# Altium project LattePanda.PrjPcb (part 1 of 2)
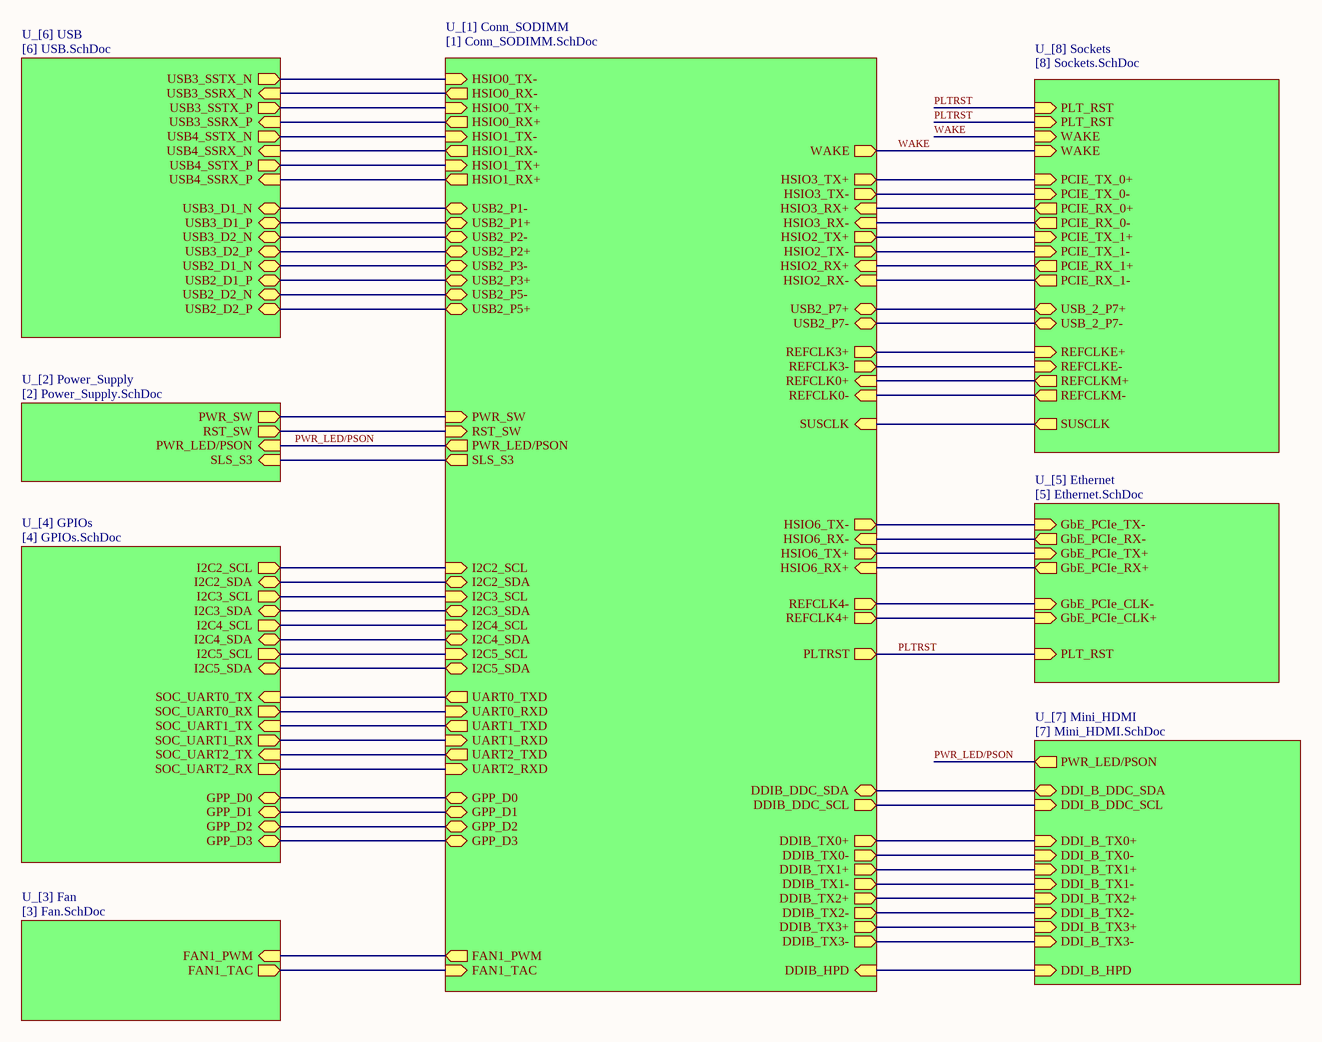
[diagram p0: [0] LattePanda_Mu.SchDoc]
8 sheets, 181 parts. Net scope: hierarchical (ports join the sheet entries above them; power ports are global).
Board file: LattePanda_Mu.PcbDoc
Sheets:
  [0] LattePanda_Mu.SchDoc
    U_[1] Conn_SODIMM = [1] Conn_SODIMM.SchDoc
    U_[2] Power_Supply = [2] Power_Supply.SchDoc
    U_[5] Ethernet = [5] Ethernet.SchDoc
    U_[6] USB = [6] USB.SchDoc
    U_[7] Mini_HDMI = [7] Mini_HDMI.SchDoc
    U_[8] Sockets = [8] Sockets.SchDoc
    U_[3] Fan = [3] Fan.SchDoc

## Sheet [0] LattePanda_Mu.SchDoc
size B; Organization: Altium Limited; Address1: L3, 12a Rodborough Rd; Address2: Frenchs Forest; Address3: NSW; Address4: Australia 2086

### Sub-sheets
U_[1] Conn_SODIMM = [1] Conn_SODIMM.SchDoc: SLS_S3 (out), HSIO2_TX+ (out), HSIO2_TX- (out), HSIO3_TX+ (out), HSIO3_TX- (out), HSIO6_TX+ (out), HSIO6_TX- (out), HSIO2_RX+ (in), HSIO2_RX- (in), HSIO3_RX+ (in), HSIO3_RX- (in), HSIO6_RX+ (in), HSIO6_RX- (in), USB2_P1- (bidir), USB2_P1+ (bidir), USB2_P2+ (bidir), USB2_P2- (bidir), USB2_P3+ (bidir), USB2_P3- (bidir), USB2_P7+ (bidir), USB2_P7- (bidir), DDIB_HPD (in), DDIB_DDC_SDA (bidir), DDIB_DDC_SCL (out), DDIB_TX3+ (out), DDIB_TX3- (out), DDIB_TX2+ (out), DDIB_TX2- (out), DDIB_TX1+ (out), DDIB_TX1- (out), DDIB_TX0+ (out), DDIB_TX0- (out), FAN1_TAC (in), FAN1_PWM (out), WAKE (out), PLTRST (out), USB2_P5+ (bidir), USB2_P5- (bidir), SUSCLK (in), GPP_D0 (bidir), GPP_D1 (bidir), GPP_D2 (bidir), GPP_D3 (bidir), UART0_RXD (in), UART0_TXD (out), UART1_RXD (in), UART1_TXD (out), UART2_RXD (in), UART2_TXD (out), I2C2_SDA (bidir), I2C3_SDA (bidir), I2C4_SDA (bidir), I2C5_SDA (bidir), I2C2_SCL (in), I2C3_SCL (in), I2C4_SCL (in), I2C5_SCL (in), PWR_SW (in), RST_SW (in), PWR_LED/PSON (out), HSIO0_TX+ (in), HSIO1_RX- (out), HSIO1_RX+ (out), HSIO0_RX- (out), HSIO0_RX+ (out), HSIO1_TX- (in), HSIO1_TX+ (in), HSIO0_TX- (in), REFCLK4+ (out), REFCLK4- (out), REFCLK0- (in), REFCLK0+ (in), REFCLK3+ (out), REFCLK3- (out)
U_[2] Power_Supply = [2] Power_Supply.SchDoc: SLS_S3 (in), PWR_LED/PSON (in), PWR_SW (out), RST_SW (out)
U_[3] Fan = [3] Fan.SchDoc: FAN1_TAC (out), FAN1_PWM (in)
U_[4] GPIOs = [4] GPIOs.SchDoc (file not in this document): I2C2_SDA (bidir), I2C3_SDA (bidir), I2C4_SDA (bidir), I2C5_SDA (bidir), I2C2_SCL (out), I2C3_SCL (out), I2C4_SCL (out), I2C5_SCL (out), SOC_UART0_RX (out), SOC_UART1_RX (out), SOC_UART2_RX (out), SOC_UART0_TX (in), SOC_UART1_TX (in), SOC_UART2_TX (in), GPP_D0 (bidir), GPP_D1 (bidir), GPP_D2 (bidir), GPP_D3 (bidir)
U_[5] Ethernet = [5] Ethernet.SchDoc: GbE_PCIe_TX- (in), GbE_PCIe_TX+ (in), GbE_PCIe_RX- (out), GbE_PCIe_RX+ (out), GbE_PCIe_CLK- (in), GbE_PCIe_CLK+ (in), PLT_RST (in)
U_[6] USB = [6] USB.SchDoc: USB3_SSRX_N (in), USB3_SSRX_P (in), USB3_SSTX_N (out), USB3_SSTX_P (out), USB4_SSRX_N (in), USB4_SSRX_P (in), USB4_SSTX_N (out), USB4_SSTX_P (out), USB2_D2_P (bidir), USB2_D1_P (bidir), USB3_D1_P (bidir), USB2_D1_N (bidir), USB3_D2_P (bidir), USB3_D1_N (bidir), USB3_D2_N (bidir), USB2_D2_N (bidir)
U_[7] Mini_HDMI = [7] Mini_HDMI.SchDoc: DDI_B_TX0+ (in), DDI_B_TX0- (in), DDI_B_TX1+ (in), DDI_B_TX1- (in), DDI_B_TX2+ (in), DDI_B_TX2- (in), DDI_B_TX3+ (in), DDI_B_TX3- (in), PWR_LED/PSON (out), DDI_B_DDC_SDA (bidir), DDI_B_HPD (in), DDI_B_DDC_SCL (in)
U_[8] Sockets = [8] Sockets.SchDoc: PLT_RST (in), WAKE (in), PCIE_TX_1+ (in), PCIE_TX_1- (in), PCIE_RX_1+ (out), PCIE_RX_1- (out), REFCLKM+ (out), REFCLKM- (out), PLT_RST (in), WAKE (in), PCIE_TX_0+ (in), PCIE_TX_0- (in), PCIE_RX_0+ (out), PCIE_RX_0- (out), USB_2_P7+ (bidir), USB_2_P7- (bidir), REFCLKE+ (in), REFCLKE- (in), SUSCLK (out)

### Nets
PLTRST: sheet U_[1] Conn_SODIMM/PLTRST, sheet U_[5] Ethernet/PLT_RST, sheet U_[8] Sockets/PLT_RST, sheet U_[8] Sockets/PLT_RST
PWR_LED/PSON: sheet U_[1] Conn_SODIMM/PWR_LED/PSON, sheet U_[2] Power_Supply/PWR_LED/PSON, sheet U_[7] Mini_HDMI/PWR_LED/PSON
PWR_SW: sheet U_[1] Conn_SODIMM/PWR_SW, sheet U_[2] Power_Supply/PWR_SW
RST_SW: sheet U_[1] Conn_SODIMM/RST_SW, sheet U_[2] Power_Supply/RST_SW
SLS_S3: sheet U_[1] Conn_SODIMM/SLS_S3, sheet U_[2] Power_Supply/SLS_S3
STDA_SSRX1_N: sheet U_[1] Conn_SODIMM/HSIO0_RX-, sheet U_[6] USB/USB3_SSRX_N
STDA_SSRX1_P: sheet U_[1] Conn_SODIMM/HSIO0_RX+, sheet U_[6] USB/USB3_SSRX_P
STDA_SSRX2_N: sheet U_[1] Conn_SODIMM/HSIO1_RX-, sheet U_[6] USB/USB4_SSRX_N
STDA_SSRX2_P: sheet U_[1] Conn_SODIMM/HSIO1_RX+, sheet U_[6] USB/USB4_SSRX_P
TMD_CK_N: sheet U_[1] Conn_SODIMM/DDIB_TX3-, sheet U_[7] Mini_HDMI/DDI_B_TX3-
TMD_CK_P: sheet U_[1] Conn_SODIMM/DDIB_TX3+, sheet U_[7] Mini_HDMI/DDI_B_TX3+
TMD_D0_N: sheet U_[1] Conn_SODIMM/DDIB_TX2-, sheet U_[7] Mini_HDMI/DDI_B_TX2-
TMD_D0_P: sheet U_[1] Conn_SODIMM/DDIB_TX2+, sheet U_[7] Mini_HDMI/DDI_B_TX2+
TMD_D1_N: sheet U_[1] Conn_SODIMM/DDIB_TX1-, sheet U_[7] Mini_HDMI/DDI_B_TX1-
TMD_D1_P: sheet U_[1] Conn_SODIMM/DDIB_TX1+, sheet U_[7] Mini_HDMI/DDI_B_TX1+
TMD_D2_N: sheet U_[1] Conn_SODIMM/DDIB_TX0-, sheet U_[7] Mini_HDMI/DDI_B_TX0-
TMD_D2_P: sheet U_[1] Conn_SODIMM/DDIB_TX0+, sheet U_[7] Mini_HDMI/DDI_B_TX0+
USB2_D1_N: sheet U_[1] Conn_SODIMM/USB2_P3-, sheet U_[6] USB/USB2_D1_N
USB2_D1_P: sheet U_[1] Conn_SODIMM/USB2_P3+, sheet U_[6] USB/USB2_D1_P
USB2_D2_N: sheet U_[1] Conn_SODIMM/USB2_P5-, sheet U_[6] USB/USB2_D2_N
USB2_D2_P: sheet U_[1] Conn_SODIMM/USB2_P5+, sheet U_[6] USB/USB2_D2_P
USB3_D1_N: sheet U_[1] Conn_SODIMM/USB2_P1-, sheet U_[6] USB/USB3_D1_N
USB3_D1_P: sheet U_[1] Conn_SODIMM/USB2_P1+, sheet U_[6] USB/USB3_D1_P
USB3_D2_N: sheet U_[1] Conn_SODIMM/USB2_P2-, sheet U_[6] USB/USB3_D2_N
USB3_D2_P: sheet U_[1] Conn_SODIMM/USB2_P2+, sheet U_[6] USB/USB3_D2_P
USB3_SSTX_N: sheet U_[1] Conn_SODIMM/HSIO0_TX-, sheet U_[6] USB/USB3_SSTX_N
USB3_SSTX_P: sheet U_[1] Conn_SODIMM/HSIO0_TX+, sheet U_[6] USB/USB3_SSTX_P
USB4_SSTX_N: sheet U_[1] Conn_SODIMM/HSIO1_TX-, sheet U_[6] USB/USB4_SSTX_N
USB4_SSTX_P: sheet U_[1] Conn_SODIMM/HSIO1_TX+, sheet U_[6] USB/USB4_SSTX_P
WAKE: sheet U_[1] Conn_SODIMM/WAKE, sheet U_[8] Sockets/WAKE, sheet U_[8] Sockets/WAKE
NetC30_2: sheet U_[1] Conn_SODIMM/HSIO6_TX-, sheet U_[5] Ethernet/GbE_PCIe_TX-
NetC31_2: sheet U_[1] Conn_SODIMM/HSIO6_TX+, sheet U_[5] Ethernet/GbE_PCIe_TX+
NetC32_2: sheet U_[1] Conn_SODIMM/HSIO6_RX-, sheet U_[5] Ethernet/GbE_PCIe_RX-
NetC33_2: sheet U_[1] Conn_SODIMM/HSIO6_RX+, sheet U_[5] Ethernet/GbE_PCIe_RX+
NetC57_2: sheet U_[1] Conn_SODIMM/HSIO3_TX+, sheet U_[8] Sockets/PCIE_TX_0+
NetC58_2: sheet U_[1] Conn_SODIMM/HSIO3_TX-, sheet U_[8] Sockets/PCIE_TX_0-
NetC59_2: sheet U_[1] Conn_SODIMM/HSIO2_TX+, sheet U_[8] Sockets/PCIE_TX_1+
NetC60_2: sheet U_[1] Conn_SODIMM/HSIO2_TX-, sheet U_[8] Sockets/PCIE_TX_1-
NetJ3_2: sheet U_[1] Conn_SODIMM/FAN1_PWM, sheet U_[3] Fan/FAN1_PWM
NetJ3_4: sheet U_[1] Conn_SODIMM/FAN1_TAC, sheet U_[3] Fan/FAN1_TAC
NetJ3_28: sheet U_[1] Conn_SODIMM/HSIO2_RX+, sheet U_[8] Sockets/PCIE_RX_1+
NetJ3_30: sheet U_[1] Conn_SODIMM/HSIO2_RX-, sheet U_[8] Sockets/PCIE_RX_1-
NetJ3_34: sheet U_[1] Conn_SODIMM/HSIO3_RX+, sheet U_[8] Sockets/PCIE_RX_0+
NetJ3_36: sheet U_[1] Conn_SODIMM/HSIO3_RX-, sheet U_[8] Sockets/PCIE_RX_0-
NetJ3_76: sheet U_[1] Conn_SODIMM/USB2_P7+, sheet U_[8] Sockets/USB_2_P7+
NetJ3_78: sheet U_[1] Conn_SODIMM/USB2_P7-, sheet U_[8] Sockets/USB_2_P7-
NetJ3_85: sheet U_[1] Conn_SODIMM/REFCLK0+, sheet U_[8] Sockets/REFCLKM+
NetJ3_87: sheet U_[1] Conn_SODIMM/REFCLK0-, sheet U_[8] Sockets/REFCLKM-
NetJ3_88: sheet U_[1] Conn_SODIMM/REFCLK3+, sheet U_[8] Sockets/REFCLKE+
NetJ3_90: sheet U_[1] Conn_SODIMM/REFCLK3-, sheet U_[8] Sockets/REFCLKE-
NetJ3_94: sheet U_[1] Conn_SODIMM/REFCLK4+, sheet U_[5] Ethernet/GbE_PCIe_CLK+
NetJ3_96: sheet U_[1] Conn_SODIMM/REFCLK4-, sheet U_[5] Ethernet/GbE_PCIe_CLK-
NetJ3_128: sheet U_[1] Conn_SODIMM/GPP_D0, sheet U_[4] GPIOs/GPP_D0
NetJ3_130: sheet U_[1] Conn_SODIMM/GPP_D1, sheet U_[4] GPIOs/GPP_D1
NetJ3_131: sheet U_[1] Conn_SODIMM/SUSCLK, sheet U_[8] Sockets/SUSCLK
NetJ3_132: sheet U_[1] Conn_SODIMM/GPP_D2, sheet U_[4] GPIOs/GPP_D2
NetJ3_134: sheet U_[1] Conn_SODIMM/GPP_D3, sheet U_[4] GPIOs/GPP_D3
NetJ3_137: sheet U_[1] Conn_SODIMM/UART0_RXD, sheet U_[4] GPIOs/SOC_UART0_RX
NetJ3_138: sheet U_[1] Conn_SODIMM/UART2_TXD, sheet U_[4] GPIOs/SOC_UART2_TX
NetJ3_139: sheet U_[1] Conn_SODIMM/UART0_TXD, sheet U_[4] GPIOs/SOC_UART0_TX
NetJ3_140: sheet U_[1] Conn_SODIMM/UART2_RXD, sheet U_[4] GPIOs/SOC_UART2_RX
NetJ3_141: sheet U_[1] Conn_SODIMM/UART1_RXD, sheet U_[4] GPIOs/SOC_UART1_RX
NetJ3_142: sheet U_[1] Conn_SODIMM/I2C5_SCL, sheet U_[4] GPIOs/I2C5_SCL
NetJ3_143: sheet U_[1] Conn_SODIMM/UART1_TXD, sheet U_[4] GPIOs/SOC_UART1_TX
NetJ3_144: sheet U_[1] Conn_SODIMM/I2C5_SDA, sheet U_[4] GPIOs/I2C5_SDA
NetJ3_146: sheet U_[1] Conn_SODIMM/I2C4_SCL, sheet U_[4] GPIOs/I2C4_SCL
NetJ3_148: sheet U_[1] Conn_SODIMM/I2C4_SDA, sheet U_[4] GPIOs/I2C4_SDA
NetJ3_150: sheet U_[1] Conn_SODIMM/I2C3_SCL, sheet U_[4] GPIOs/I2C3_SCL
NetJ3_152: sheet U_[1] Conn_SODIMM/I2C3_SDA, sheet U_[4] GPIOs/I2C3_SDA
NetJ3_154: sheet U_[1] Conn_SODIMM/I2C2_SCL, sheet U_[4] GPIOs/I2C2_SCL
NetJ3_156: sheet U_[1] Conn_SODIMM/I2C2_SDA, sheet U_[4] GPIOs/I2C2_SDA
NetJ3_169: sheet U_[1] Conn_SODIMM/DDIB_DDC_SDA, sheet U_[7] Mini_HDMI/DDI_B_DDC_SDA
NetJ3_171: sheet U_[1] Conn_SODIMM/DDIB_DDC_SCL, sheet U_[7] Mini_HDMI/DDI_B_DDC_SCL
NetJ3_183: sheet U_[1] Conn_SODIMM/DDIB_HPD, sheet U_[7] Mini_HDMI/DDI_B_HPD

### Notes on the sheet
- Title
- Size:
- Date:
- B
- Number:
- Time:
- Revision:
- Sheet
- of
- File:

## Sheet [1] Conn_SODIMM.SchDoc
size A2 portrait; Organization: Altium Limited; Address1: L3, 12a Rodborough Rd; Address2: Frenchs Forest; Address3: NSW; Address4: Australia 2086
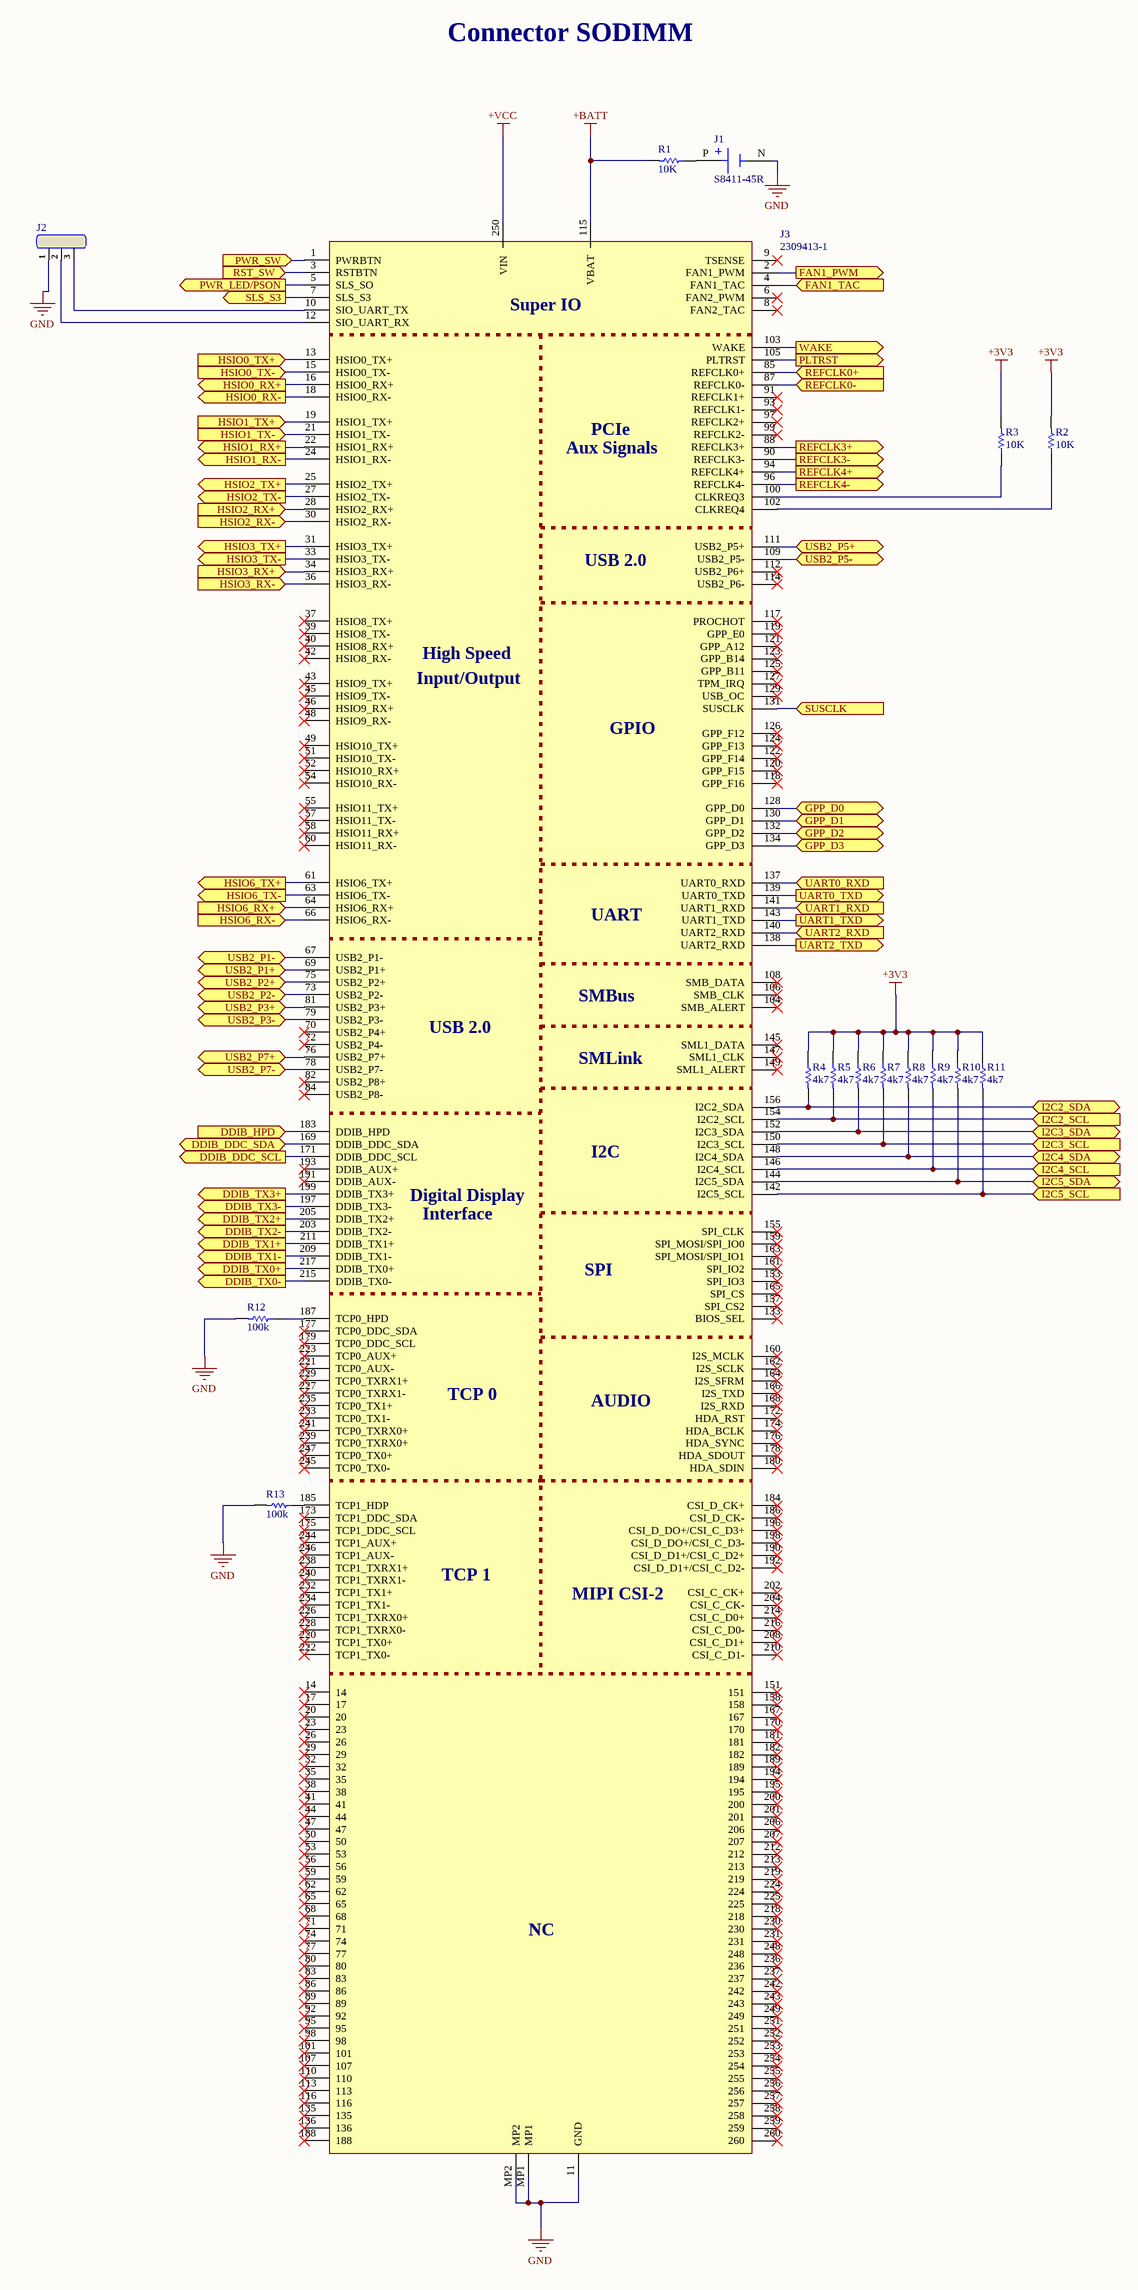
[diagram p1: [1] Conn_SODIMM.SchDoc]

### Parts
J1  S8411-45R  [HARWIN_S8411-45R]
J2  Header 3x1  [HM 3X1]  (value not drawn)
J3  2309413-1  [23094131]
R1  10K  [Resistencia 0402]
R2  10K  [Resistencia 0402]
R3  10K  [Resistencia 0402]
R4  4k7  [Resistencia 0402]
R5  4k7  [Resistencia 0402]
R6  4k7  [Resistencia 0402]
R7  4k7  [Resistencia 0402]
R8  4k7  [Resistencia 0402]
R9  4k7  [Resistencia 0402]
R10  4k7  [Resistencia 0402]
R11  4k7  [Resistencia 0402]
R12  100k  [Resistencia 0402]
R13  100k  [Resistencia 0402]

### Ports
DDIB_DDC_SCL (out), DDIB_DDC_SDA (bidir), DDIB_HPD (in), DDIB_TX0+ (out), DDIB_TX0- (out), DDIB_TX1+ (out), DDIB_TX1- (out), DDIB_TX2+ (out), DDIB_TX2- (out), DDIB_TX3+ (out), DDIB_TX3- (out), FAN1_PWM (out), FAN1_TAC (in), GPP_D0 (bidir), GPP_D1 (bidir), GPP_D2 (bidir), GPP_D3 (bidir), HSIO0_RX+ (out), HSIO0_RX- (out), HSIO0_TX+ (in), HSIO0_TX- (in), HSIO1_RX+ (out), HSIO1_RX- (out), HSIO1_TX+ (in), HSIO1_TX- (in), HSIO2_RX+ (in), HSIO2_RX- (in), HSIO2_TX+ (out), HSIO2_TX- (out), HSIO3_RX+ (in), HSIO3_RX- (in), HSIO3_TX+ (out), HSIO3_TX- (out), HSIO6_RX+ (in), HSIO6_RX- (in), HSIO6_TX+ (out), HSIO6_TX- (out), I2C2_SCL (in), I2C2_SDA (bidir), I2C3_SCL (in), I2C3_SDA (bidir), I2C4_SCL (in), I2C4_SDA (bidir), I2C5_SCL (in), I2C5_SDA (bidir), PLTRST (out), PWR_LED/PSON (out), PWR_SW (in), REFCLK0+ (in), REFCLK0- (in), REFCLK3+ (out), REFCLK3- (out), REFCLK4+ (out), REFCLK4- (out), RST_SW (in), SLS_S3 (out), SUSCLK (in), UART0_RXD (in), UART0_TXD (out), UART1_RXD (in), UART1_TXD (out), UART2_RXD (in), UART2_TXD (out), USB2_P1+ (bidir), USB2_P1- (bidir), USB2_P2+ (bidir), USB2_P2- (bidir), USB2_P3+ (bidir), USB2_P3- (bidir), USB2_P5+ (bidir), USB2_P5- (bidir), USB2_P7+ (bidir), USB2_P7- (bidir), WAKE (out)

### Nets
+3V3: R2.1(A) R3.1(A) R4.2(B) R5.2(B) R6.2(B) R7.2(B) R8.2(B) R9.2(B) R10.2(B) R11.2(B)
+BATT: J3.115(VBAT) R1.1(A)
+VCC: J3.250(VIN)
GND: J1.N(NEG) J2.1 J3.11(GND) J3.MP1 J3.MP2 R12.1(A) R13.1(A)
PLTRST: J3.105(PLTRST) ; port PLTRST
PWR_LED/PSON: J3.5(SLS_SO) ; port PWR_LED/PSON
PWR_SW: J3.1(PWRBTN) ; port PWR_SW
RST_SW: J3.3(RSTBTN) ; port RST_SW
SLS_S3: J3.7(SLS_S3) ; port SLS_S3
STDA_SSRX1_N: J3.18(HSIO0_RX-) ; port HSIO0_RX-
STDA_SSRX1_P: J3.16(HSIO0_RX+) ; port HSIO0_RX+
STDA_SSRX2_N: J3.24(HSIO1_RX-) ; port HSIO1_RX-
STDA_SSRX2_P: J3.22(HSIO1_RX+) ; port HSIO1_RX+
TMD_CK_N: J3.197(DDIB_TX3-) ; port DDIB_TX3-
TMD_CK_P: J3.199(DDIB_TX3+) ; port DDIB_TX3+
TMD_D0_N: J3.203(DDIB_TX2-) ; port DDIB_TX2-
TMD_D0_P: J3.205(DDIB_TX2+) ; port DDIB_TX2+
TMD_D1_N: J3.209(DDIB_TX1-) ; port DDIB_TX1-
TMD_D1_P: J3.211(DDIB_TX1+) ; port DDIB_TX1+
TMD_D2_N: J3.215(DDIB_TX0-) ; port DDIB_TX0-
TMD_D2_P: J3.217(DDIB_TX0+) ; port DDIB_TX0+
USB2_D1_N: J3.79(USB2_P3-) ; port USB2_P3-
USB2_D1_P: J3.81(USB2_P3+) ; port USB2_P3+
USB2_D2_N: J3.109(USB2_P5-) ; port USB2_P5-
USB2_D2_P: J3.111(USB2_P5+) ; port USB2_P5+
USB3_D1_N: J3.67(USB2_P1-) ; port USB2_P1-
USB3_D1_P: J3.69(USB2_P1+) ; port USB2_P1+
USB3_D2_N: J3.73(USB2_P2-) ; port USB2_P2-
USB3_D2_P: J3.75(USB2_P2+) ; port USB2_P2+
USB3_SSTX_N: J3.15(HSIO0_TX-) ; port HSIO0_TX-
USB3_SSTX_P: J3.13(HSIO0_TX+) ; port HSIO0_TX+
USB4_SSTX_N: J3.21(HSIO1_TX-) ; port HSIO1_TX-
USB4_SSTX_P: J3.19(HSIO1_TX+) ; port HSIO1_TX+
WAKE: J3.103(WAKE) ; port WAKE
NetC30_2: J3.63(HSIO6_TX-) ; port HSIO6_TX-
NetC31_2: J3.61(HSIO6_TX+) ; port HSIO6_TX+
NetC32_2: J3.66(HSIO6_RX-) ; port HSIO6_RX-
NetC33_2: J3.64(HSIO6_RX+) ; port HSIO6_RX+
NetC57_2: J3.31(HSIO3_TX+) ; port HSIO3_TX+
NetC58_2: J3.33(HSIO3_TX-) ; port HSIO3_TX-
NetC59_2: J3.25(HSIO2_TX+) ; port HSIO2_TX+
NetC60_2: J3.27(HSIO2_TX-) ; port HSIO2_TX-
NetJ1_P: J1.P(POS) R1.2(B)
NetJ2_2: J2.2 J3.12(SIO_UART_RX)
NetJ2_3: J2.3 J3.10(SIO_UART_TX)
NetJ3_2: J3.2(FAN1_PWM) ; port FAN1_PWM
NetJ3_4: J3.4(FAN1_TAC) ; port FAN1_TAC
NetJ3_28: J3.28(HSIO2_RX+) ; port HSIO2_RX+
NetJ3_30: J3.30(HSIO2_RX-) ; port HSIO2_RX-
NetJ3_34: J3.34(HSIO3_RX+) ; port HSIO3_RX+
NetJ3_36: J3.36(HSIO3_RX-) ; port HSIO3_RX-
NetJ3_76: J3.76(USB2_P7+) ; port USB2_P7+
NetJ3_78: J3.78(USB2_P7-) ; port USB2_P7-
NetJ3_85: J3.85(REFCLK0+) ; port REFCLK0+
NetJ3_87: J3.87(REFCLK0-) ; port REFCLK0-
NetJ3_88: J3.88(REFCLK3+) ; port REFCLK3+
NetJ3_90: J3.90(REFCLK3-) ; port REFCLK3-
NetJ3_94: J3.94(REFCLK4+) ; port REFCLK4+
NetJ3_96: J3.96(REFCLK4-) ; port REFCLK4-
NetJ3_100: J3.100(CLKREQ3) R3.2(B)
NetJ3_102: J3.102(CLKREQ4) R2.2(B)
NetJ3_128: J3.128(GPP_D0) ; port GPP_D0
NetJ3_130: J3.130(GPP_D1) ; port GPP_D1
NetJ3_131: J3.131(SUSCLK) ; port SUSCLK
NetJ3_132: J3.132(GPP_D2) ; port GPP_D2
NetJ3_134: J3.134(GPP_D3) ; port GPP_D3
NetJ3_137: J3.137(UART0_RXD) ; port UART0_RXD
NetJ3_138: J3.138(UART2_RXD) ; port UART2_TXD
NetJ3_139: J3.139(UART0_TXD) ; port UART0_TXD
NetJ3_140: J3.140(UART2_RXD) ; port UART2_RXD
NetJ3_141: J3.141(UART1_RXD) ; port UART1_RXD
NetJ3_142: J3.142(I2C5_SCL) R11.1(A) ; port I2C5_SCL
NetJ3_143: J3.143(UART1_TXD) ; port UART1_TXD
NetJ3_144: J3.144(I2C5_SDA) R10.1(A) ; port I2C5_SDA
NetJ3_146: J3.146(I2C4_SCL) R9.1(A) ; port I2C4_SCL
NetJ3_148: J3.148(I2C4_SDA) R8.1(A) ; port I2C4_SDA
NetJ3_150: J3.150(I2C3_SCL) R7.1(A) ; port I2C3_SCL
NetJ3_152: J3.152(I2C3_SDA) R6.1(A) ; port I2C3_SDA
NetJ3_154: J3.154(I2C2_SCL) R5.1(A) ; port I2C2_SCL
NetJ3_156: J3.156(I2C2_SDA) R4.1(A) ; port I2C2_SDA
NetJ3_169: J3.169(DDIB_DDC_SDA) ; port DDIB_DDC_SDA
NetJ3_171: J3.171(DDIB_DDC_SCL) ; port DDIB_DDC_SCL
NetJ3_183: J3.183(DDIB_HPD) ; port DDIB_HPD
NetJ3_185: J3.185(TCP1_HDP) R13.2(B)
NetJ3_187: J3.187(TCP0_HPD) R12.2(B)

Not connected (* = marked no-connect by the designer): J3 6(FAN2_PWM)* 8(FAN2_TAC)* 9(TSENSE)* 14* 17* 20* 23* 26* 29* 32* 35* 37(HSIO8_TX+)* 38* 39(HSIO8_TX-)* 40(HSIO8_RX+)* 41* 42(HSIO8_RX-)* 43(HSIO9_TX+)* 44* 45(HSIO9_TX-)* 46(HSIO9_RX+)* 47* 48(HSIO9_RX-)* 49(HSIO10_TX+)* 50* 51(HSIO10_TX-)* 52(HSIO10_RX+)* 53* 54(HSIO10_RX-)* 55(HSIO11_TX+)* 56* 57(HSIO11_TX-)* 58(HSIO11_RX+)* 59* 60(HSIO11_RX-)* 62* 65* 68* 70(USB2_P4+)* 71* 72(USB2_P4-)* 74* 77* 80* 82(USB2_P8+)* 83* 84(USB2_P8-)* 86* 89* 91(REFCLK1+)* 92* 93(REFCLK1-)* 95* 97(REFCLK2+)* 98* 99(REFCLK2-)* 101* 104(SMB_ALERT)* 106(SMB_CLK)* 107* 108(SMB_DATA)* 110* 112(USB2_P6+)* 113* 114(USB2_P6-)* 116* 117(PROCHOT)* 118(GPP_F16)* 119(GPP_E0)* 120(GPP_F15)* 121(GPP_A12)* 122(GPP_F14)* 123(GPP_B14)* 124(GPP_F13)* 125(GPP_B11)* 126(GPP_F12)* 127(TPM_IRQ)* 129(USB_OC)* 133(BIOS_SEL)* 135* 136* 145(SML1_DATA)* 147(SML1_CLK)* 149(SML1_ALERT)* 151* 153(SPI_IO3)* 155(SPI_CLK)* 157(SPI_CS2)* 158* 159(SPI_MOSI/SPI_IO0)* 160(I2S_MCLK)* 161(SPI_IO2)* 162(I2S_SCLK)* 163(SPI_MOSI/SPI_IO1)* 164(I2S_SFRM)* 165(SPI_CS)* 166(I2S_TXD)* 167* 168(I2S_RXD)* 170* 172(HDA_RST)* 173(TCP1_DDC_SDA)* 174(HDA_BCLK)* 175(TCP1_DDC_SCL)* 176(HDA_SYNC)* 177(TCP0_DDC_SDA)* 178(HDA_SDOUT)* 179(TCP0_DDC_SCL)* 180(HDA_SDIN)* 181* 182* 184(CSI_D_CK+)* 186(CSI_D_CK-)* 188* 189* 190(CSI_D_D1+/CSI_C_D2+)* 191(DDIB_AUX-)* 192(CSI_D_D1+/CSI_C_D2-)* 193(DDIB_AUX+)* 194* 195* 196(CSI_D_DO+/CSI_C_D3+)* 198(CSI_D_DO+/CSI_C_D3-)* 200* 201* 202(CSI_C_CK+)* 204(CSI_C_CK-)* 206* 207* 208(CSI_C_D1+)* 210(CSI_C_D1-)* 212* 213* 214(CSI_C_D0+)* 216(CSI_C_D0-)* 218* 219* 220(TCP1_TX0+)* 221(TCP0_AUX-)* 222(TCP1_TX0-)* 223(TCP0_AUX+)* 224* 225* 226(TCP1_TXRX0+)* 227(TCP0_TXRX1-)* 228(TCP1_TXRX0-)* 229(TCP0_TXRX1+)* 230* 231* 232(TCP1_TX1+)* 233(TCP0_TX1-)* 234(TCP1_TX1-)* 235(TCP0_TX1+)* 236* 237* 238(TCP1_TXRX1+)* 239(TCP0_TXRX0+)* 240(TCP1_TXRX1-)* 241(TCP0_TXRX0+)* 242* 243* 244(TCP1_AUX+)* 245(TCP0_TX0-)* 246(TCP1_AUX-)* 247(TCP0_TX0+)* 248* 249* 251* 252* 253* 254* 255* 256* 257* 258* 259* 260*

### Notes on the sheet
- Connector SODIMM
- Title
- Size:
- Date:
- File:
- A2
- Number:
- Time:
- Revision:
- Sheet
- of
- (in symbol 2309413-1) Super IO; PCIe; Aux Signals; USB 2.0; High Speed; Input/Output; GPIO; UART; SMBus; SMLink; I2C; Digital Display; Interface; SPI; TCP 0; AUDIO; TCP 1; MIPI CSI-2; NC

### Library data of the parts
J1 = S8411-45R: Coin Cell Battery Retainer, Horizontal SMT, for CR1220 Coin Cell Batteries, Tape & Reeled; MF: Harwin; SnapEDA_Link: https://www.snapeda.com/parts/S8411-45R/Harwin+Inc./view-part/?ref=snap; Package: None; Value: *; MP: S8411-45R; Check_prices: https://www.snapeda.com/parts/S8411-45R/Harwin+Inc./view-part/?ref=eda
J2 = HM 3x1: Header Macho 3x1 2.54mm
J3 = 2309413-1: Body Features: Module Key Type Offset Left; Manufacturer_Name: TE Connectivity; Geometry.Height: 9.45mm; Mouser Part Number: 571-2309413-1; Mouser Price/Stock: https://www.mouser.co.uk/ProductDetail/TE-Connectivity/2309413-1?qs=1mbolxNpo8ckNkoYMswDaw%3D%3D; Manufacturer_Part_Number: 2309413-1; Datasheet Link: https://www.te.com/commerce/DocumentDelivery/DDEController?Action=showdoc&DocId=Customer+Drawing%7F2309413%7F3%7Fpdf%7FEnglish%7FENG_CD_2309413_3.pdf%7F2309413-1
R1-R13 = Resistencia SMD 0402

## Sheet [2] Power_Supply.SchDoc
size C; Organization: Altium Limited; Address1: L3, 12a Rodborough Rd; Address2: Frenchs Forest; Address3: NSW; Address4: Australia 2086
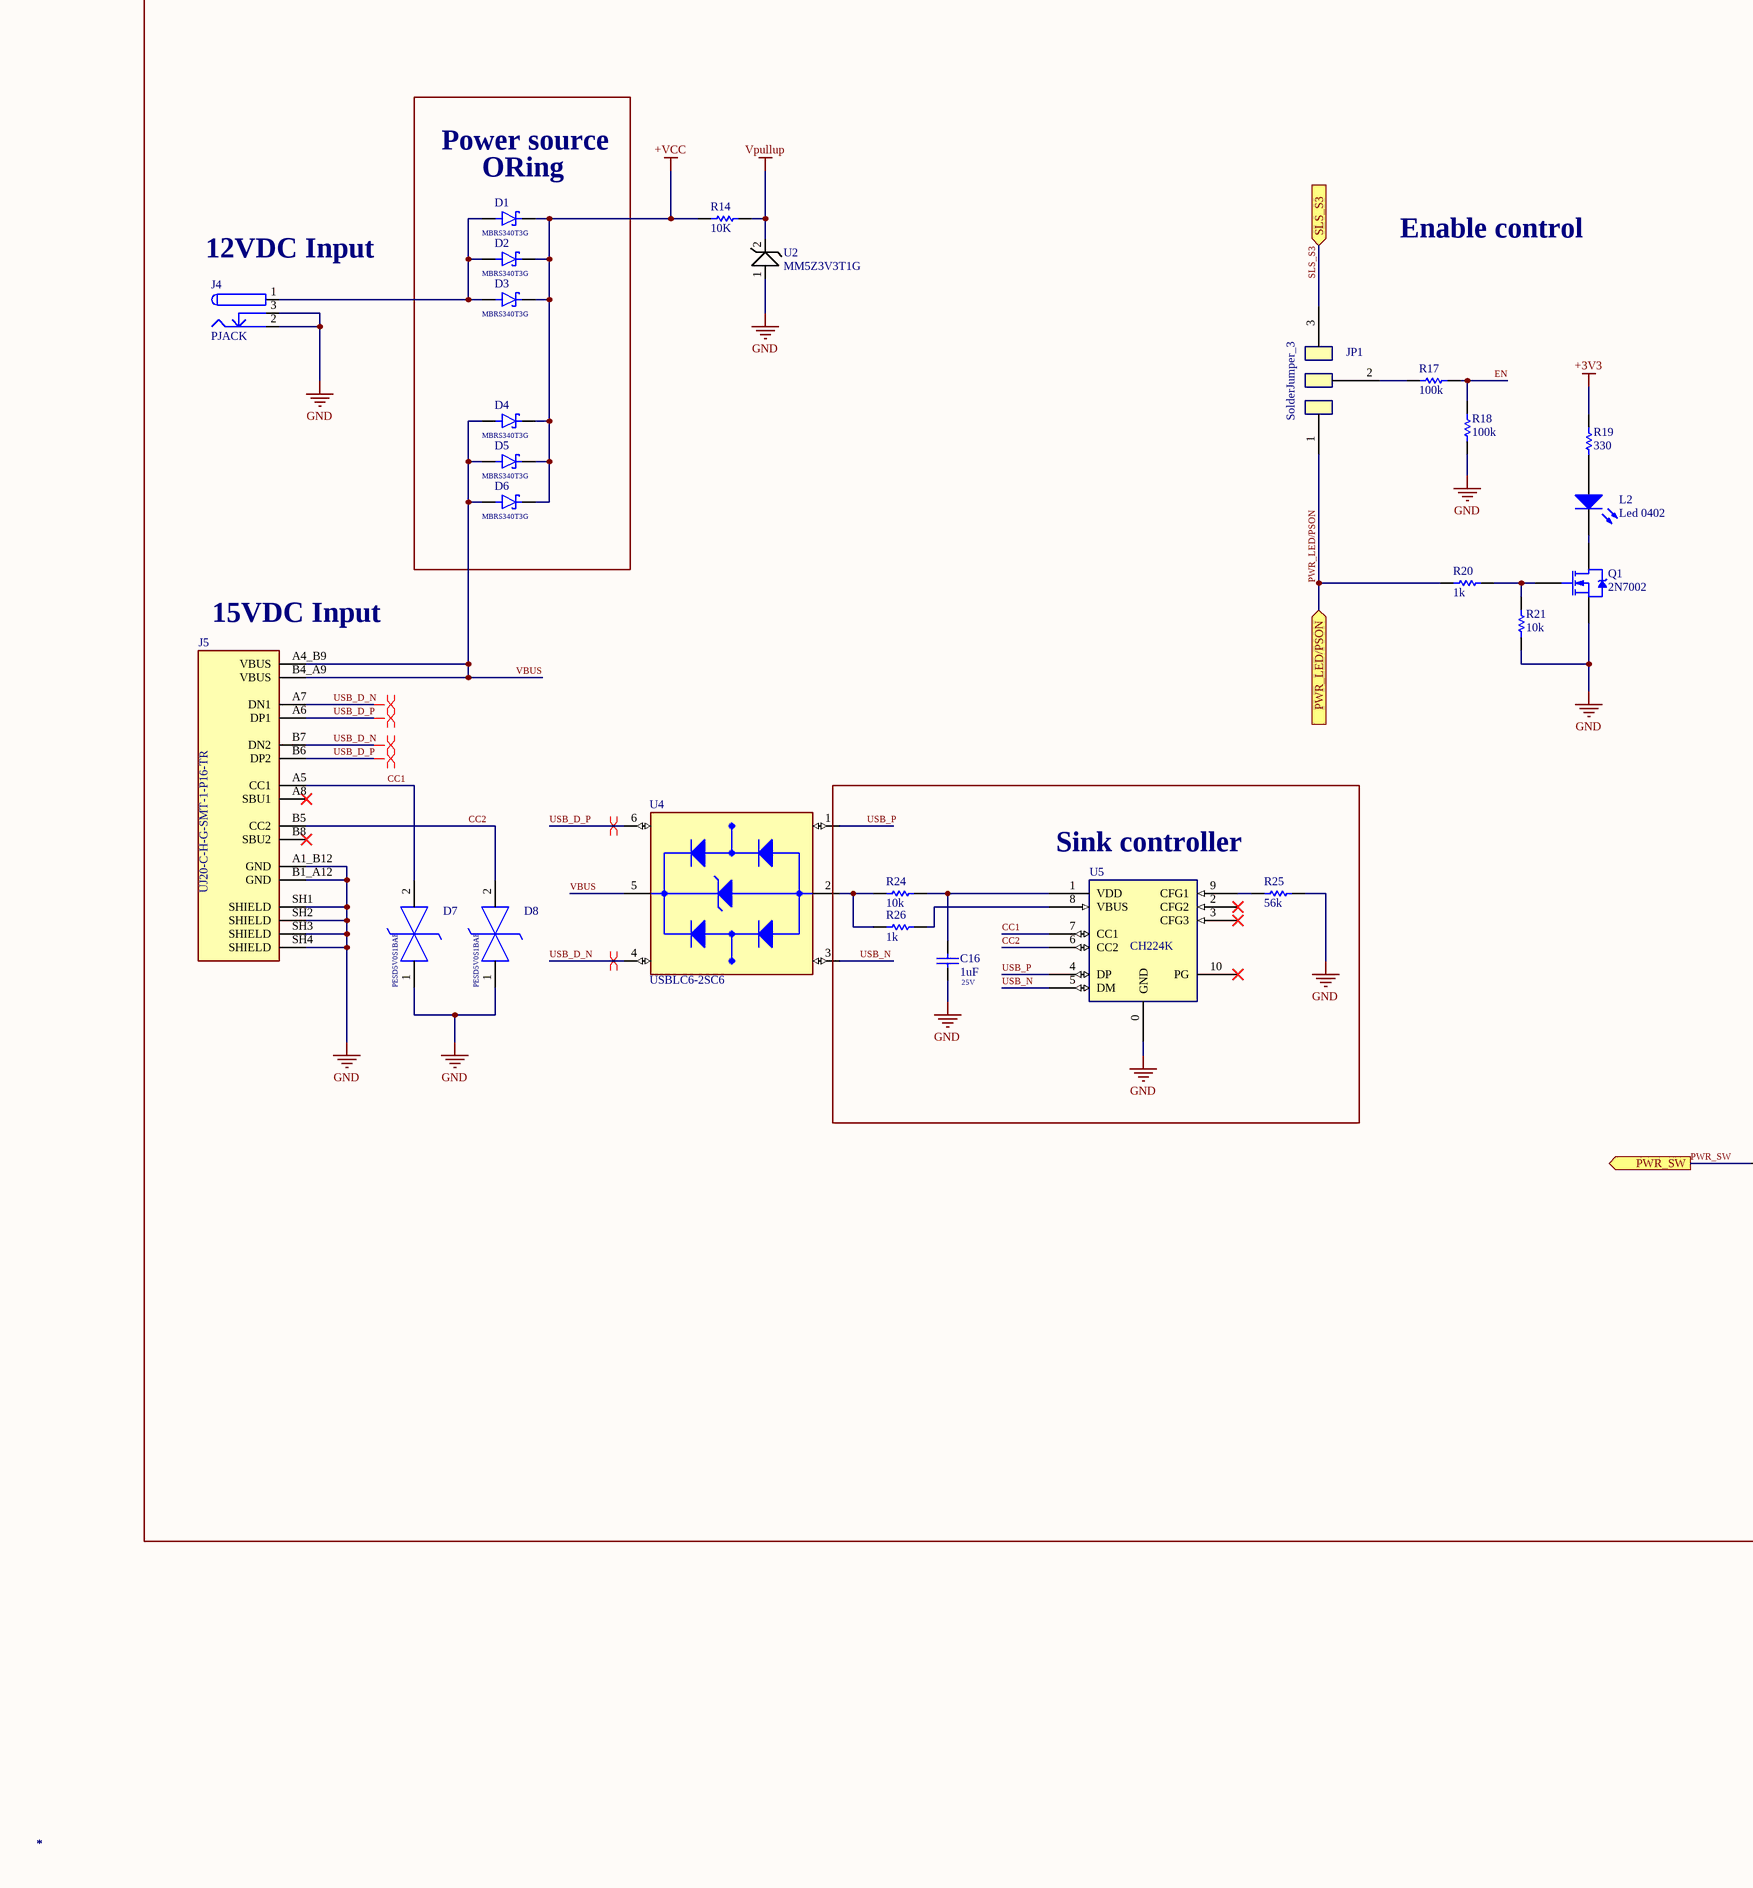
[diagram p2: [2] Power_Supply.SchDoc, left]
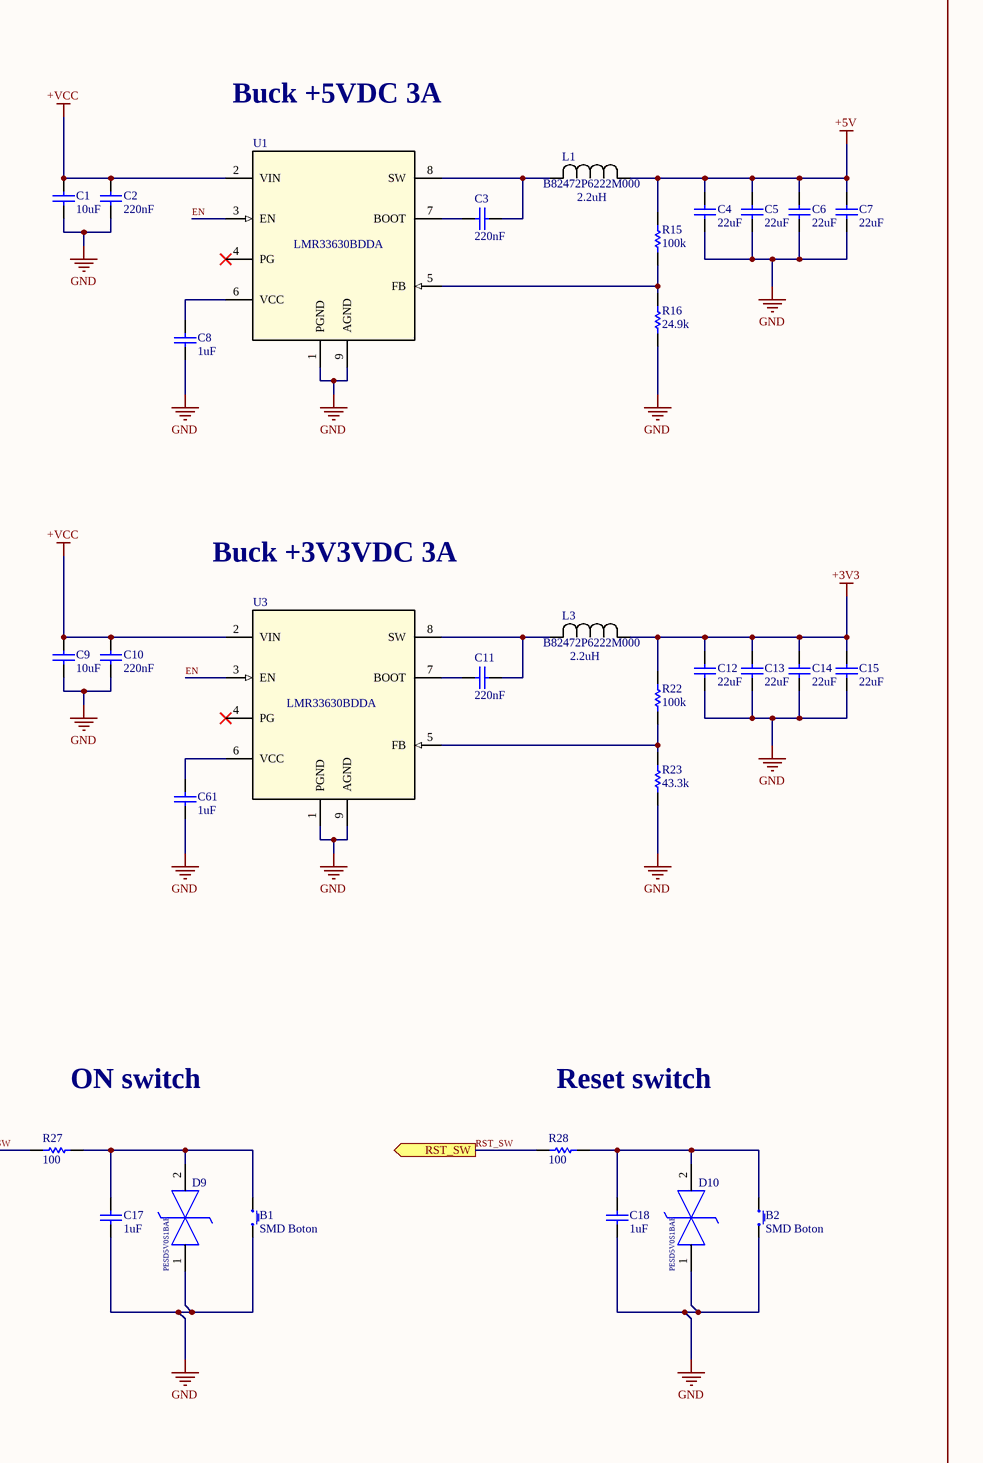
[diagram p3: [2] Power_Supply.SchDoc, right]

### Parts
B1  SMD Boton  [Push Boton Nano 2 Pin]
B2  SMD Boton  [Push Boton Nano 2 Pin]
C1  10uF  [CAPACITOR 0805]
C2  220nF  [Capacitor 0402]
C3  220nF  [Capacitor 0402]
C4  22uF  [Capacitor 0603]
C5  22uF  [Capacitor 0603]
C6  22uF  [Capacitor 0603]
C7  22uF  [Capacitor 0603]
C8  1uF  [Capacitor 0402]
C9  10uF  [CAPACITOR 0805]
C10  220nF  [Capacitor 0402]
C11  220nF  [Capacitor 0402]
C12  22uF  [Capacitor 0603]
C13  22uF  [Capacitor 0603]
C14  22uF  [Capacitor 0603]
C15  22uF  [Capacitor 0603]
C16  1uF  [Capacitor 0402]
C17  1uF  [Capacitor 0402]
C18  1uF  [Capacitor 0402]
C61  1uF  [Capacitor 0402]
D1  MBRS340T3G  [DIOM7959X261N]
D2  MBRS340T3G  [DIOM7959X261N]
D3  MBRS340T3G  [DIOM7959X261N]
D4  MBRS340T3G  [DIOM7959X261N]
D5  MBRS340T3G  [DIOM7959X261N]
D6  MBRS340T3G  [DIOM7959X261N]
D7  PESD5V0S1BAF  [SOD2512X110N]
D8  PESD5V0S1BAF  [SOD2512X110N]
D9  PESD5V0S1BAF  [SOD2512X110N]
D10  PESD5V0S1BAF  [SOD2512X110N]
J4  PJACK  [JACK DC]
J5  UJ20-C-H-G-SMT-1-P16-TR  [SAMESKY_UJ20-C-H-G-SMT-1-P16-TR]
JP1  (no value)  [SolderJumper-3_P1.3mm_Bridged12]
L1  B82472P6222M000  [IND_EPCOS_B82472P6_EPC]
L2  Led 0402  [LED 0402]
L3  B82472P6222M000  [IND_EPCOS_B82472P6_EPC]
Q1  2N7002  [SOT23127P600-8N]
R14  10K  [Resistencia 0402]
R15  100k  [Resistencia 0402]
R16  24.9k  [Resistencia 0402]
R17  100k  [Resistencia 0402]
R18  100k  [Resistencia 0402]
R19  330  [Resistencia 0402]
R20  1k  [Resistencia 0402]
R21  10k  [Resistencia 0402]
R22  100k  [Resistencia 0402]
R23  43.3k  [Resistencia 0402]
R24  10k  [Resistencia 0402]
R25  56k  [Resistencia 0402]
R26  1k  [Resistencia 0402]
R27  100  [Resistencia 0402]
R28  100  [Resistencia 0402]
U1  LMR33630BDDA  [DDA0008J]
U2  MM5Z3V3T1G  [SOD-523_0P9X1P3_ONS]
U3  LMR33630BDDA  [DDA0008J]
U4  USBLC6-2SC6  [SOT95P280X145-6N]
U5  (no value)  [ESSOP-10_CH224K]

### Blocks framed on the sheet
Sink controller: C16 R24-R26 U5

### Ports
PWR_LED/PSON (in), PWR_SW (out), RST_SW (out), SLS_S3 (in)

### Nets
+3V3: C12.2 C13.2 C14.2 C15.2 L3.1 R19.2(B) R22.2(B)
+5V: C4.2 C5.2 C6.2 C7.2 L1.1 R15.2(B)
+VCC: C1.2 C2.2 C9.2 C10.2 D1.C(K) D2.C(K) D3.C(K) D4.C(K) D5.C(K) D6.C(K) R14.1(A) U1.2(VIN) U3.2(VIN)
GND: B1.2 B2.2 C1.1 C2.1 C4.1 C5.1 C6.1 C7.1 C8.1 C9.1 C10.1 C12.1 C13.1 C14.1 C15.1 C16.1 C17.1 C18.1 C61.1 D7.1(K1) D8.1(K1) D9.1(K1) D10.1(K1) J4.2 J4.3 J5.A1_B12(GND) J5.B1_A12(GND) J5.SH1(SHIELD) J5.SH2(SHIELD) J5.SH3(SHIELD) J5.SH4(SHIELD) Q1.2(S) R16.1(A) R18.2(B) R21.1(A) R23.1(A) R25.2(B) U1.1(PGND) U1.9(AGND) U2.1(CATHODE) U3.1(PGND) U3.9(AGND) U5.0(GND)
Vpullup: R14.2(B) U2.2(ANODE)
CC1: D7.2(K2) J5.A5(CC1) U5.7(CC1)
CC2: D8.2(K2) J5.B5(CC2) U5.6(CC2)
EN: R17.1(A) R18.1(A) U1.3(EN) U3.3(EN)
PWR_LED/PSON: R20.2(B) ; port PWR_LED/PSON
PWR_SW: R27.2(B) ; port PWR_SW
RST_SW: R28.2(B) ; port RST_SW
USB_D_N: J5.A7(DN1) J5.B7(DN2) U4.4(I/O2_OUT)
USB_D_P: J5.A6(DP1) J5.B6(DP2) U4.6(I/O1_OUT)
USB_N: U4.3(I/O2_IN) U5.5(DM)
USB_P: U4.1(I/O1_IN) U5.4(DP)
VBUS: D4.A D5.A D6.A J5.A4_B9(VBUS) J5.B4_A9(VBUS) U4.5(VBUS)
NetB1_1: B1.1 C17.2 D9.2(K2) R27.1(A)
NetB2_1: B2.1 C18.2 D10.2(K2) R28.1(A)
NetC3_1: C3.1 U1.7(BOOT)
NetC3_2: C3.2 L1.2 U1.8(SW)
NetC8_2: C8.2 U1.6(VCC)
NetC11_1: C11.1 U3.7(BOOT)
NetC11_2: C11.2 L3.2 U3.8(SW)
NetC16_2: C16.2 R24.2(B) U5.1(VDD)
NetC61_2: C61.2 U3.6(VCC)
NetD1_A: D1.A D2.A D3.A J4.1
NetL2_1: L2.1(A) R19.1(A)
NetL2_2: L2.2(K) Q1.3(D)
NetQ1_1: Q1.1(G) R20.1(A) R21.2(B)
NetR15_1: R15.1(A) R16.2(B) U1.5(FB)
NetR22_1: R22.1(A) R23.2(B) U3.5(FB)
NetR24_1: R24.1(A) R26.1(A) U4.2(GND)
NetR25_1: R25.1(A) U5.9(CFG1)
NetR26_2: R26.2(B) U5.8(VBUS)

Not connected (* = marked no-connect by the designer): J5 A8(SBU1)* B8(SBU2)*; JP1 1(A) 2(C) 3(B); R17 2(B); U1 4(PG)*; U3 4(PG)*; U5 2(CFG2)* 3(CFG3)* 10(PG)*

### Layout directives
differential pair: USB_D_N, USB_D_P

### Notes on the sheet
- Buck +5VDC 3A
- Power source
- (near D1) ORing
- (near J4) 12VDC Input
- Enable control
- (near L1) 2.2uH
- Buck +3V3VDC 3A
- (near J5) 15VDC Input
- (near L3) 2.2uH
- (near C16) 25V
- ON switch
- Reset switch
- Title
- Size:
- Date:
- File:
- C
- Number:
- Time:
- Revision:
- Sheet
- of

### Library data of the parts
B1 B2 = Push Boton 2 Pin SMD: Micro Push
C1 C9 = Capacitor 0805: Capacitor Cerámico SMD 0805
C2 C3 C8 C10 C11 C16-C18 C61 = Capacitor 0402: Capacitor Ceramico SMD 0402
C4-C7 C12-C15 = Capacitor 0603: Capacitor Ceramico SMD 0603
D1-D6 = MBRS340T3G: Diode Schottky 40 V 3A Surface Mount SMC; MF: ON Semiconductor; SnapEDA_Link: https://www.snapeda.com/parts/MBRS340T3G/Onsemi/view-part/?ref=snap; Package: SMC-2 ON Semiconductor; Value: *; MP: MBRS340T3G; Check_prices: https://www.snapeda.com/parts/MBRS340T3G/Onsemi/view-part/?ref=eda
D7-D10 = PESD5V0S1BAF: ESD Suppressors / TVS Diodes PESD5V0S1BA/SOD323/SOD2; Manufacturer_Name: Nexperia; Geometry.Height: 1.1mm; Mouser Part Number: 771-PESD5V0S1BAF; Mouser Price/Stock: https://www.mouser.co.uk/ProductDetail/Nexperia/PESD5V0S1BAF?qs=45Avz0nZxhtk8Fj2r0tKWQ%3D%3D; Manufacturer_Part_Number: PESD5V0S1BAF; Datasheet Link: https://assets.nexperia.com/documents/data-sheet/PESD5V0S1BA.pdf
J4 = JACK DC 2.1mm: Power Jack DC
J5 = UJ20-C-H-G-SMT-1-P16-TR: USB-C (USB TYPE-C) USB 2.0 Receptacle Connector 24 (16+8 Dummy) Position Surface Mount, Right Angle; Through Hole; MF: Same Sky; SnapEDA_Link: https://www.snapeda.com/parts/UJ20-C-H-G-SMT-1-P16-TR/Same+Sky/view-part/?ref=snap; Package: None; Value: *; MP: UJ20-C-H-G-SMT-1-P16-TR; Check_prices: https://www.snapeda.com/parts/UJ20-C-H-G-SMT-1-P16-TR/Same+Sky/view-part/?ref=eda
JP1 = SolderJumper_3: Solder jumper de 3 pads; Package: SolderJumper-3_P1.3mm
L1 L3 = B82472P6222M000: No Description Available; Manufacturer_Name: TDK Epcos; Copyright: Copyright (C) 2026 Ultra Librarian. All rights reserved.; Manufacturer_Part_Number: B82472P6222M000
L2 = LED 0402: LED SMD 0402
Q1 = 2N7002: Mosfet N SOT23
R14-R28 = Resistencia SMD 0402
U1 U3 = LMR33630BDDA: Reductor Reguladores de conmutación IC Positivo Ajuste 1V 1 Salida 3A 8-PowerSOIC (0.154", 3.90mm de ancho); Manufacturer_Name: Texas Instruments; Manufacturer_Part_Number: LMR33630ADDAR; TYPE: TYPE; RefDes: RefDes; Copyright: Copyright (C) 2026 Ultra Librarian. All rights reserved.
U2 = MM5Z3V3T1G: Description; Manufacturer_Name: onsemi; Copyright: Copyright (C) 2026 Ultra Librarian. All rights reserved.; Manufacturer_Part_Number: MM5Z3V3T1G; RefDes: RefDes; Type: Type
U4 = USBLC6-2SC6: 17V Clamp 5A (8/20Âµs) Ipp Tvs Diode Surface Mount SOT-23-6; MF: STMicroelectronics; Value: *; SnapEDA_Link: https://www.snapeda.com/parts/USBLC6-2SC6/STMicroelectronics/view-part/?ref=snap; Check_prices: https://www.snapeda.com/parts/USBLC6-2SC6/STMicroelectronics/view-part/?ref=eda; Purchase-URL: https://pricing.snapeda.com/search/part/USBLC6-2SC6/?ref=eda; Price: None; Availability: In Stock; Package: SOT-23-6 STMicroelectronics; MP: USBLC6-2SC6
U5 = CH224K: USB PD3.0/2.0 + BC1.2 sink controller, 100 W, ESSOP-10; Manufacturer: WCH (Jiangsu Qin Heng); Manufacturer Part Number: CH224K; Package: ESSOP-10-150mil-1mm

## Sheet [5] Ethernet.SchDoc
size B; Organization: Altium Limited; Address1: L3, 12a Rodborough Rd; Address2: Frenchs Forest; Address3: NSW; Address4: Australia 2086
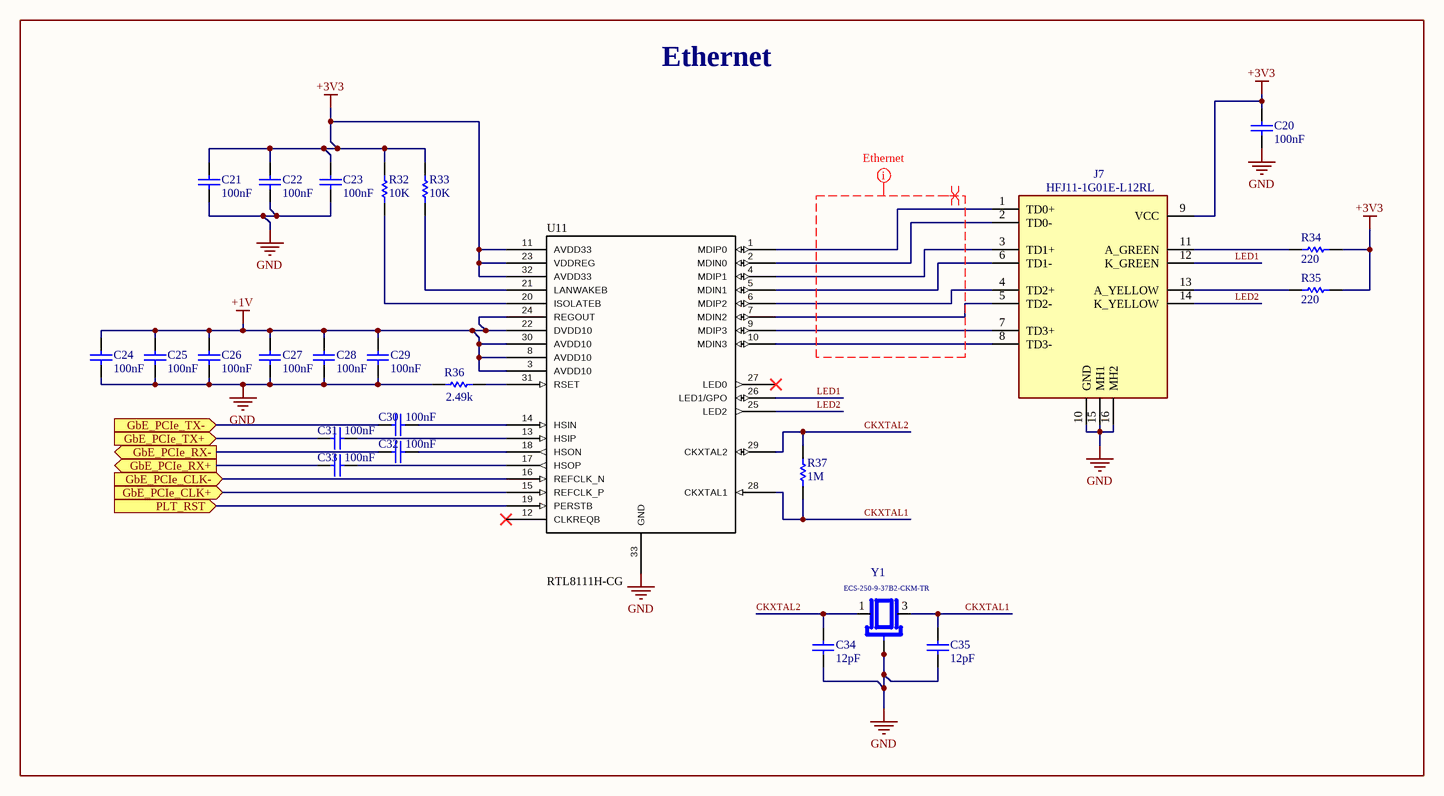
[diagram p4: [5] Ethernet.SchDoc]

### Parts
C20  100nF  [Capacitor 0402]
C21  100nF  [Capacitor 0402]
C22  100nF  [Capacitor 0402]
C23  100nF  [Capacitor 0402]
C24  100nF  [Capacitor 0402]
C25  100nF  [Capacitor 0402]
C26  100nF  [Capacitor 0402]
C27  100nF  [Capacitor 0402]
C28  100nF  [Capacitor 0402]
C29  100nF  [Capacitor 0402]
C30  100nF  [Capacitor 0402]
C31  100nF  [Capacitor 0402]
C32  100nF  [Capacitor 0402]
C33  100nF  [Capacitor 0402]
C34  12pF  [Capacitor 0402]
C35  12pF  [Capacitor 0402]
J7  HFJ11-1G01E-L12RL  [HFJ111G01EL12RL]
R32  10K  [Resistencia 0402]
R33  10K  [Resistencia 0402]
R34  220  [Resistencia 0402]
R35  220  [Resistencia 0402]
R36  2.49k  [Resistencia 0402]
R37  1M  [Resistencia 0402]
U11  RTL8111H-CG  [RTL8111H-CG]
Y1  ECS-250-9-37B2-CKM-TR  [XTAL_ECS-250-9-37B2-CKM-TR]

### Blocks framed on the sheet
Ethernet: C20-C35 J7 R32-R37 U11 Y1

### Ports
GbE_PCIe_CLK+ (in), GbE_PCIe_CLK- (in), GbE_PCIe_RX+ (out), GbE_PCIe_RX- (out), GbE_PCIe_TX+ (in), GbE_PCIe_TX- (in), PLT_RST (in)

### Nets
+1V: C24.2 C25.2 C26.2 C27.2 C28.2 C29.2 U11.3(AVDD10) U11.8(AVDD10) U11.22(DVDD10) U11.24(REGOUT) U11.30(AVDD10)
+3V3: C20.2 C21.2 C22.2 C23.2 J7.9(VCC) R32.2(B) R33.2(B) R34.1(A) R35.1(A) U11.11(AVDD33) U11.23(VDDREG) U11.32(AVDD33)
GND: C20.1 C21.1 C22.1 C23.1 C24.1 C25.1 C26.1 C27.1 C28.1 C29.1 C34.1 C35.1 J7.10(GND) J7.15(MH1) J7.16(MH2) R36.2(B) U11.33(GND) Y1.2(GND) Y1.4(GND)
CKXTAL1: C35.2 R37.2(B) U11.28(CKXTAL1) Y1.3(OUT/IN)
CKXTAL2: C34.2 R37.1(A) U11.29(CKXTAL2) Y1.1(IN/OUT)
LED1: J7.12(K_GREEN) U11.26(LED1/GPO)
LED2: J7.14(K_YELLOW) U11.25(LED2)
PLTRST: U11.19(PERSTB) ; port PLT_RST
NetC30_1: C30.1 U11.14(HSIN)
NetC30_2: C30.2 ; port GbE_PCIe_TX-
NetC31_1: C31.1 U11.13(HSIP)
NetC31_2: C31.2 ; port GbE_PCIe_TX+
NetC32_1: C32.1 U11.18(HSON)
NetC32_2: C32.2 ; port GbE_PCIe_RX-
NetC33_1: C33.1 U11.17(HSOP)
NetC33_2: C33.2 ; port GbE_PCIe_RX+
NetJ3_94: U11.15(REFCLK_P) ; port GbE_PCIe_CLK+
NetJ3_96: U11.16(REFCLK_N) ; port GbE_PCIe_CLK-
NetJ7_1: J7.1(TD0+) U11.1(MDIP0)
NetJ7_2: J7.2(TD0-) U11.2(MDIN0)
NetJ7_3: J7.3(TD1+) U11.4(MDIP1)
NetJ7_4: J7.4(TD2+) U11.6(MDIP2)
NetJ7_5: J7.5(TD2-) U11.7(MDIN2)
NetJ7_6: J7.6(TD1-) U11.5(MDIN1)
NetJ7_7: J7.7(TD3+) U11.9(MDIP3)
NetJ7_8: J7.8(TD3-) U11.10(MDIN3)
NetJ7_11: J7.11(A_GREEN) R34.2(B)
NetJ7_13: J7.13(A_YELLOW) R35.2(B)
NetR32_1: R32.1(A) U11.20(ISOLATEB)
NetR33_1: R33.1(A) U11.21(LANWAKEB)
NetR36_1: R36.1(A) U11.31(RSET)

Not connected (* = marked no-connect by the designer): U11 12(CLKREQB)* 27(LED0)*

### Layout directives
mark named Ethernet: (no net found under the mark)
differential pair; differential pair class 100_OHM_DIFF: (no net found under the mark)

### Notes on the sheet
- Title
- Size:
- Date:
- B
- Number:
- Time:
- Revision:
- Sheet
- of
- File:

### Library data of the parts
C20-C35 = Capacitor 0402: Capacitor Ceramico SMD 0402
J7 = HFJ11-1G01E-L12RL: Modular Connectors / Ethernet Connectors GIGABIT 1x1 Tab Down RJ45 w/mag Y/G LED 350uH min 0C ~ 70C; Manufacturer_Name: Halo Electronics; Geometry.Height: 15.64mm; Mouser Part Number: 493-HFJ111G01EL12RL; Mouser Price/Stock: https://www.mouser.co.uk/ProductDetail/HALO-Electronics/HFJ11-1G01E-L12RL?qs=8uu3sA0mUdsaxIpTwn1s5A%3D%3D; Manufacturer_Part_Number: HFJ11-1G01E-L12RL; Datasheet Link: https://www.haloelectronics.com/pdf/fastjack-gigabit.pdf
R32-R37 = Resistencia SMD 0402
U11 = RTL8111H-CG: Realtek RTL8111H-CG - controlador Ethernet 10/100/1000M integrado para PCI Express, QFN-32 4x4 mm paso 0.4 mm, regulador LDO; Manufacturer: Realtek Semiconductor; Manufacturer Part Number: RTL8111H-CG; Package: QFN-32, 4x4 mm, 0.4 mm pitch, EP 2.7 mm (JEDEC MO-220); Datasheet: Realtek RTL8111H/RTL8111HS Datasheet rev 1.2
Y1 = ECS-250-9-37B2-CKM-TR: Crystal 25MHz Â±10ppm (Tol) Â±10ppm (Stability) 9pF FUND 50Ohm 4-Pin Mini-CSMD T/R; MF: ECS Inc.; SnapEDA_Link: https://www.snapeda.com/parts/ECS-250-9-37B2-CKM-TR/ECS/view-part/?ref=snap; Package: ECX-1637B-37B-4 ECS; Value: *; MP: ECS-250-9-37B2-CKM-TR; Check_prices: https://www.snapeda.com/parts/ECS-250-9-37B2-CKM-TR/ECS/view-part/?ref=eda

## Sheet [6] USB.SchDoc
size B; Organization: Altium Limited; Address1: L3, 12a Rodborough Rd; Address2: Frenchs Forest; Address3: NSW; Address4: Australia 2086
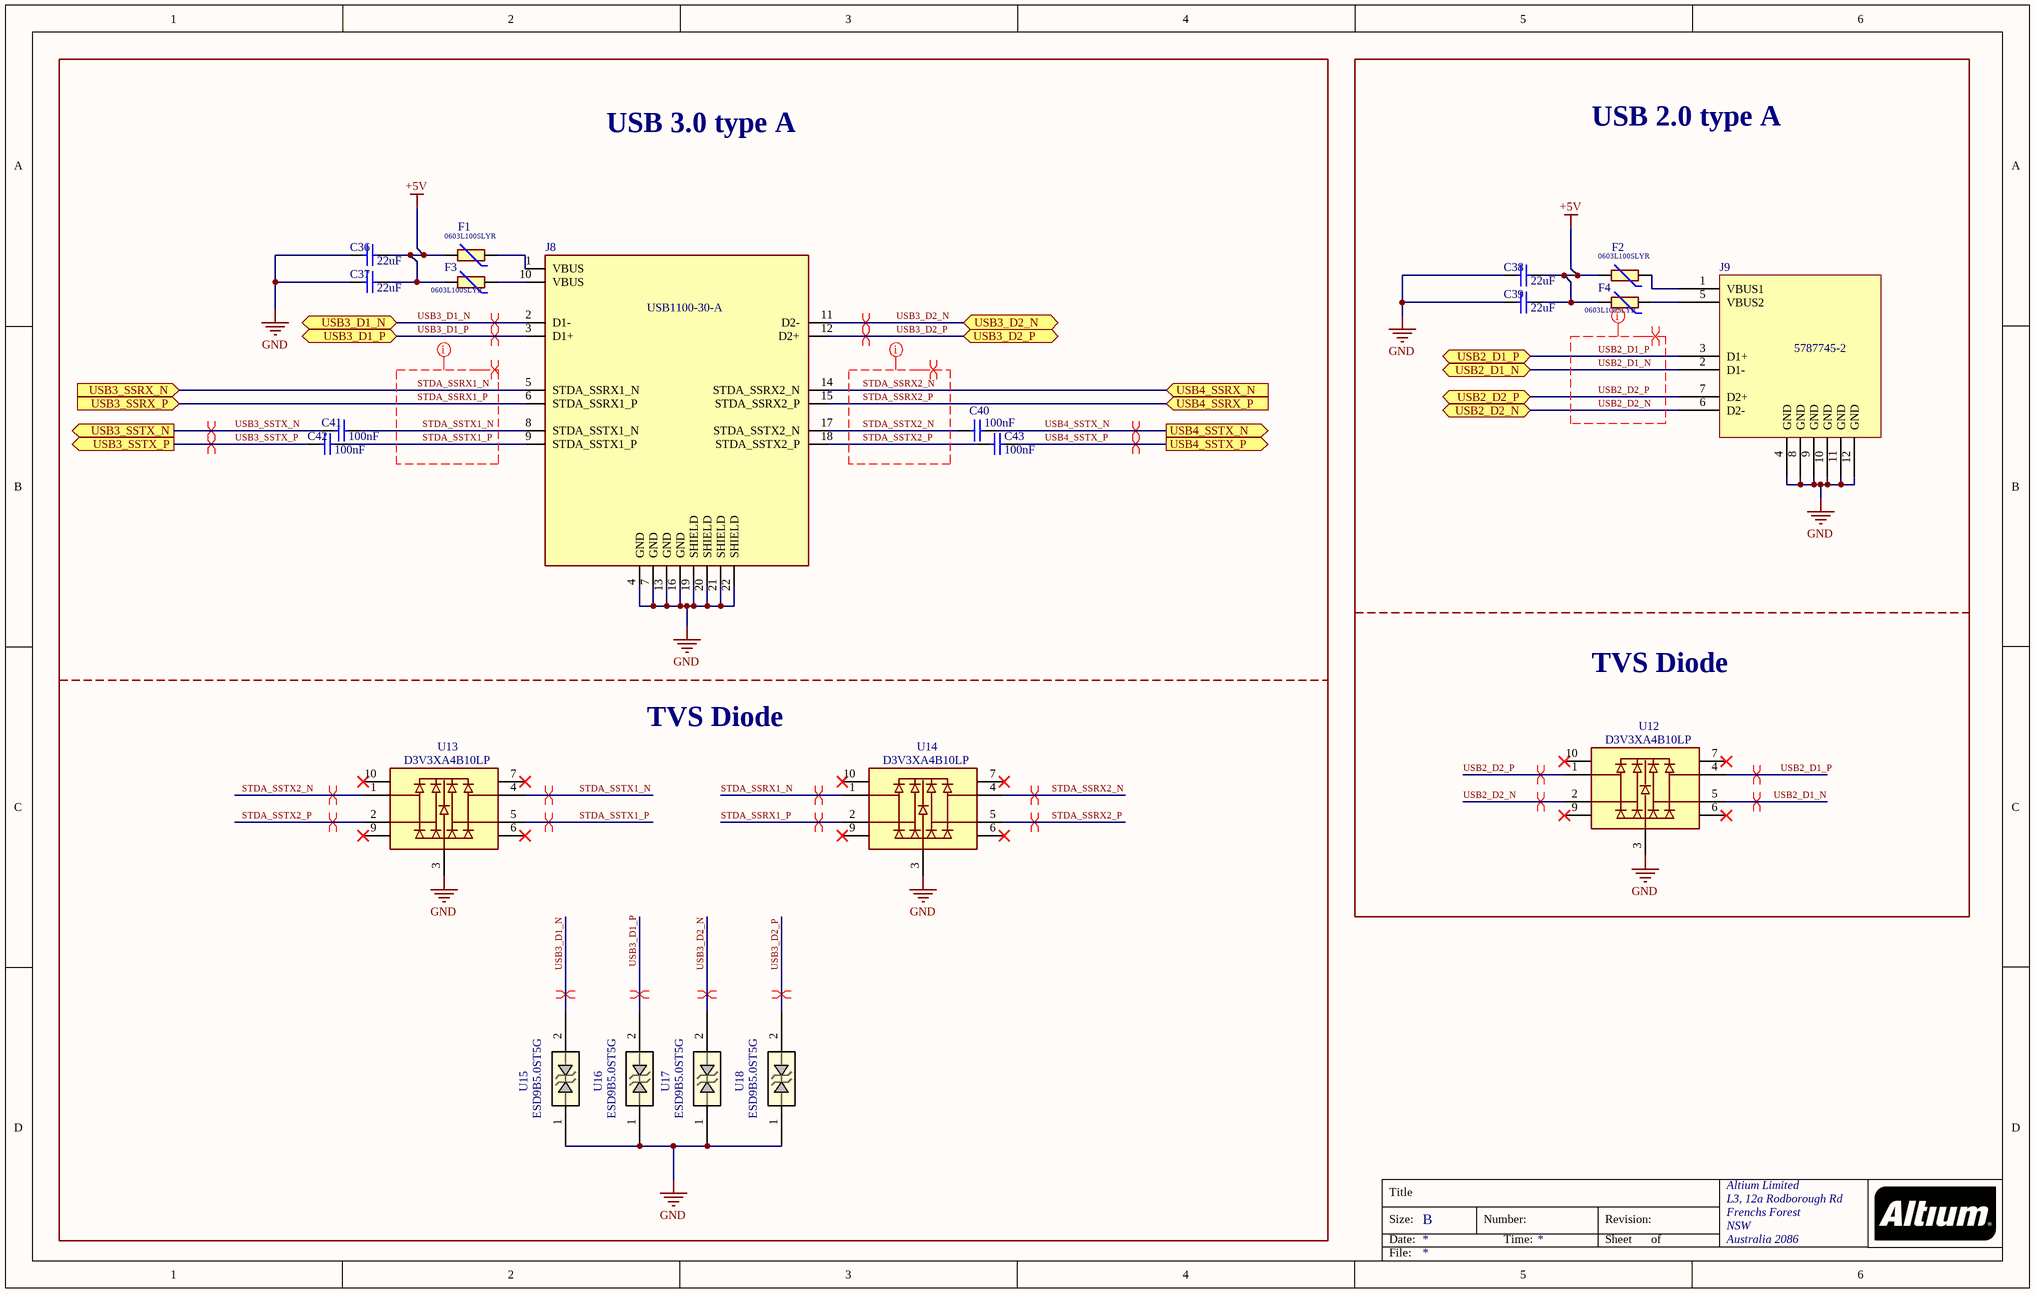
[diagram p5: [6] USB.SchDoc]

### Parts
C36  22uF  [Capacitor 0402]
C37  22uF  [Capacitor 0402]
C38  22uF  [Capacitor 0402]
C39  22uF  [Capacitor 0402]
C40  100nF  [Capacitor 0402]
C41  100nF  [Capacitor 0402]
C42  100nF  [Capacitor 0402]
C43  100nF  [Capacitor 0402]
F1  0603L100SLYR  [FUSC1608X100N]
F2  0603L100SLYR  [FUSC1608X100N]
F3  0603L100SLYR  [FUSC1608X100N]
F4  0603L100SLYR  [FUSC1608X100N]
J8  USB1100-30-A  [CONN_USB1100_GCT]
J9  5787745-2  [CONN_5787745-2_TEC]
U12  D3V3XA4B10LP  [ESDLC0524DFN10TP]
U13  D3V3XA4B10LP  [ESDLC0524DFN10TP]
U14  D3V3XA4B10LP  [ESDLC0524DFN10TP]
U15  ESD9B5.0ST5G  [SOD-923_ONS]
U16  ESD9B5.0ST5G  [SOD-923_ONS]
U17  ESD9B5.0ST5G  [SOD-923_ONS]
U18  ESD9B5.0ST5G  [SOD-923_ONS]

### Ports
USB2_D1_N (bidir), USB2_D1_P (bidir), USB2_D2_N (bidir), USB2_D2_P (bidir), USB3_D1_N (bidir), USB3_D1_P (bidir), USB3_D2_N (bidir), USB3_D2_P (bidir), USB3_SSRX_N (in), USB3_SSRX_P (in), USB3_SSTX_N (out), USB3_SSTX_P (out), USB4_SSRX_N (in), USB4_SSRX_P (in), USB4_SSTX_N (out), USB4_SSTX_P (out)

### Nets
+5V: C36.2 C37.2 C38.2 C39.2 F1.2 F2.2 F3.2 F4.2
GND: C36.1 C37.1 C38.1 C39.1 J8.4(GND) J8.7(GND) J8.13(GND) J8.16(GND) J8.19(SHIELD) J8.20(SHIELD) J8.21(SHIELD) J8.22(SHIELD) J9.4(GND) J9.8(GND) J9.9(GND) J9.10(GND) J9.11(GND) J9.12(GND) U12.3(VSS) U13.3(VSS) U14.3(VSS) U15.1 U16.1 U17.1 U18.1
STDA_SSRX1_N: J8.5(STDA_SSRX1_N) U14.1(I/O) ; port USB3_SSRX_N
STDA_SSRX1_P: J8.6(STDA_SSRX1_P) U14.2(I/O) ; port USB3_SSRX_P
STDA_SSRX2_N: J8.14(STDA_SSRX2_N) U14.4(I/O) ; port USB4_SSRX_N
STDA_SSRX2_P: J8.15(STDA_SSRX2_P) U14.5(I/O) ; port USB4_SSRX_P
STDA_SSTX1_N: C41.1 J8.8(STDA_SSTX1_N) U13.4(I/O)
STDA_SSTX1_P: C42.1 J8.9(STDA_SSTX1_P) U13.5(I/O)
STDA_SSTX2_N: C40.1 J8.17(STDA_SSTX2_N) U13.1(I/O)
STDA_SSTX2_P: C43.1 J8.18(STDA_SSTX2_P) U13.2(I/O)
USB2_D1_N: J9.2(D1-) U12.5(I/O) ; port USB2_D1_N
USB2_D1_P: J9.3(D1+) U12.4(I/O) ; port USB2_D1_P
USB2_D2_N: J9.6(D2-) U12.2(I/O) ; port USB2_D2_N
USB2_D2_P: J9.7(D2+) U12.1(I/O) ; port USB2_D2_P
USB3_D1_N: J8.2(D1-) U15.2 ; port USB3_D1_N
USB3_D1_P: J8.3(D1+) U16.2 ; port USB3_D1_P
USB3_D2_N: J8.11(D2-) U17.2 ; port USB3_D2_N
USB3_D2_P: J8.12(D2+) U18.2 ; port USB3_D2_P
USB3_SSTX_N: C41.2 ; port USB3_SSTX_N
USB3_SSTX_P: C42.2 ; port USB3_SSTX_P
USB4_SSTX_N: C40.2 ; port USB4_SSTX_N
USB4_SSTX_P: C43.2 ; port USB4_SSTX_P
NetF1_1: F1.1 J8.1(VBUS)
NetF2_1: F2.1 J9.1(VBUS1)
NetF3_1: F3.1 J8.10(VBUS)
NetF4_1: F4.1 J9.5(VBUS2)

Not connected (* = marked no-connect by the designer): U12 6(NC)* 7(NC)* 9(NC)* 10(NC)*; U13 6(NC)* 7(NC)* 9(NC)* 10(NC)*; U14 6(NC)* 7(NC)* 9(NC)* 10(NC)*

### Layout directives
mark named USB 3.0: STDA_SSRX1_N, STDA_SSRX1_P, STDA_SSRX2_N, STDA_SSRX2_P, STDA_SSTX1_N, STDA_SSTX1_P, STDA_SSTX2_N, STDA_SSTX2_P
differential pair; differential pair class 90_OHM_DIFF: STDA_SSRX1_N, STDA_SSRX1_P, STDA_SSRX2_N, STDA_SSRX2_P, STDA_SSTX1_N, STDA_SSTX1_P, STDA_SSTX2_N, STDA_SSTX2_P, USB2_D1_N, USB2_D1_P, USB2_D2_N, USB2_D2_P, USB3_D1_N, USB3_D1_P, USB3_D2_N, USB3_D2_P, USB3_SSTX_N, USB3_SSTX_P, USB4_SSTX_N, USB4_SSTX_P
mark named USB 2.0: USB2_D1_N, USB2_D1_P, USB2_D2_N, USB2_D2_P

### Notes on the sheet
- USB 3.0 type A
- USB 2.0 type A
- TVS Diode
- Title
- Size:
- Date:
- B
- Number:
- Time:
- Revision:
- Sheet
- of
- File:

### Library data of the parts
C36-C43 = Capacitor 0402: Capacitor Ceramico SMD 0402
F1-F4 = 0603L100SLYR: Fuse, Resettable, 603L Series, Polymeric, Surface Mount, 6V, 1A | Littelfuse 0603L100SLYR; SnapEDA_Link: https://www.snapeda.com/parts/0603L100SLYR/Littelfuse/view-part/?ref=snap; Package: Package; Value: *; MF: Littelfuse; MP: 0603L100SLYR; Check_prices: https://www.snapeda.com/parts/0603L100SLYR/Littelfuse/view-part/?ref=eda
J8 = USB1100-30-A: Description; Manufacturer_Name: Global Connector Technology; Copyright: Copyright (C) 2026 Ultra Librarian. All rights reserved.; Manufacturer_Part_Number: USB1100-30-A; RefDes: RefDes; Type: Type
J9 = 5787745-2: USB A R/A STAK ASSY THRU HOLE; Manufacturer_Name: TE Connectivity; Copyright: Copyright (C) 2026 Ultra Librarian. All rights reserved.; Manufacturer_Part_Number: 5787745-2; RefDes: RefDes; Type: Type
U12-U14 = D3V3XA4B10LP: 9.4V (típico) Abrazadera 4 A (8/20µs) Ipp TVS - Diodos Montaje en superficie U-DFN2510-10
U15-U18 = ESD9B5.0ST5G: Description; Manufacturer_Name: onsemi; Copyright: Copyright (C) 2025 Ultra Librarian. All rights reserved.; Manufacturer_Part_Number: ESD9B5.0ST5G; RefDes: RefDes; Type: Type

## Sheet [7] Mini_HDMI.SchDoc
size B; Organization: Altium Limited; Address1: L3, 12a Rodborough Rd; Address2: Frenchs Forest; Address3: NSW; Address4: Australia 2086
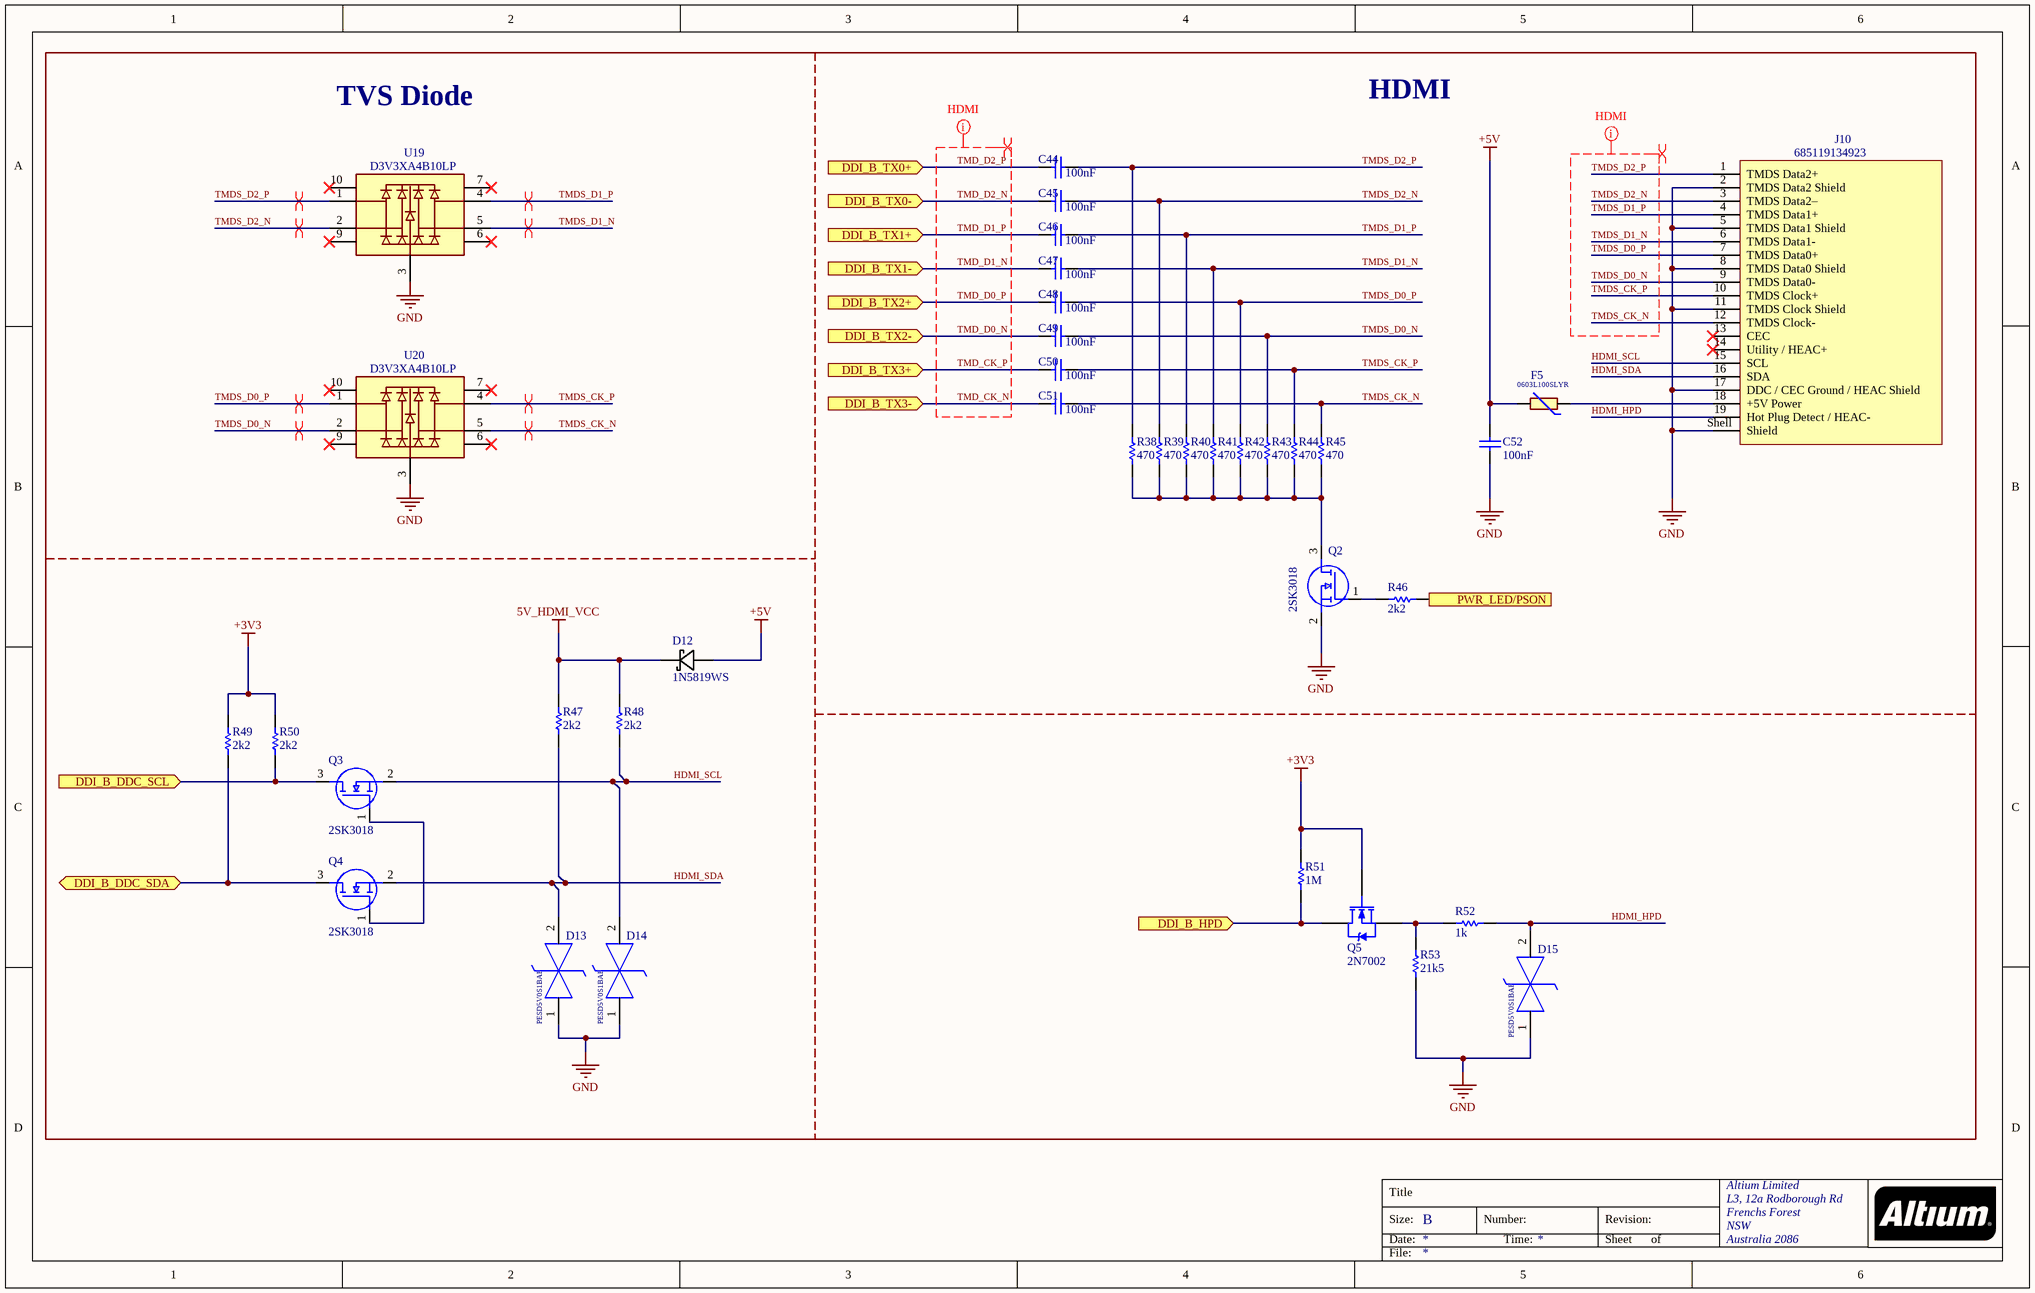
[diagram p6: [7] Mini_HDMI.SchDoc]

### Parts
C44  100nF  [Capacitor 0402]
C45  100nF  [Capacitor 0402]
C46  100nF  [Capacitor 0402]
C47  100nF  [Capacitor 0402]
C48  100nF  [Capacitor 0402]
C49  100nF  [Capacitor 0402]
C50  100nF  [Capacitor 0402]
C51  100nF  [Capacitor 0402]
C52  100nF  [Capacitor 0402]
D12  1N5819WS  [SOD-323_MCC]
D13  PESD5V0S1BAF  [SOD2512X110N]
D14  PESD5V0S1BAF  [SOD2512X110N]
D15  PESD5V0S1BAF  [SOD2512X110N]
F5  0603L100SLYR  [FUSC1608X100N]
J10  685119134923  [685119134923]
Q2  2SK3018  [SOT96P240X120-3N]
Q3  2SK3018  [SOT96P240X120-3N]
Q4  2SK3018  [SOT96P240X120-3N]
Q5  2N7002  [SOT23127P600-8N]
R38  470  [Resistencia 0402]
R39  470  [Resistencia 0402]
R40  470  [Resistencia 0402]
R41  470  [Resistencia 0402]
R42  470  [Resistencia 0402]
R43  470  [Resistencia 0402]
R44  470  [Resistencia 0402]
R45  470  [Resistencia 0402]
R46  2k2  [Resistencia 0402]
R47  2k2  [Resistencia 0402]
R48  2k2  [Resistencia 0402]
R49  2k2  [Resistencia 0402]
R50  2k2  [Resistencia 0402]
R51  1M  [Resistencia 0402]
R52  1k  [Resistencia 0402]
R53  21k5  [Resistencia 0402]
U19  D3V3XA4B10LP  [ESDLC0524DFN10TP]
U20  D3V3XA4B10LP  [ESDLC0524DFN10TP]

### Ports
DDI_B_DDC_SCL (in), DDI_B_DDC_SDA (bidir), DDI_B_HPD (in), DDI_B_TX0+ (in), DDI_B_TX0- (in), DDI_B_TX1+ (in), DDI_B_TX1- (in), DDI_B_TX2+ (in), DDI_B_TX2- (in), DDI_B_TX3+ (in), DDI_B_TX3- (in), PWR_LED/PSON (out)

### Nets
5V_HDMI_VCC: D12.1 R47.1(A) R48.1(A)
+3V3: Q5.1(G) R49.1(A) R50.1(A) R51.1(A)
+5V: C52.2 D12.2 F5.2
GND: C52.1 D13.1(K1) D14.1(K1) D15.1(K1) J10.2(TMDS_Data2_Shield) J10.5(TMDS_Data1_Shield) J10.8(TMDS_Data0_Shield) J10.11(TMDS_Clock_Shield) J10.17(DDC_/_CEC_Ground_/_HEAC_Shield) J10.Shell(Shield) Q2.2(S) R53.2(B) U19.3(VSS) U20.3(VSS)
HDMI_HPD: D15.2(K2) J10.19(Hot_Plug_Detect_/_HEAC-) R52.2(B)
HDMI_SCL: D14.2(K2) J10.15(SCL) Q3.2(S) R48.2(B)
HDMI_SDA: D13.2(K2) J10.16(SDA) Q4.2(S) R47.2(B)
PWR_LED/PSON: R46.1(A) ; port PWR_LED/PSON
TMD_CK_N: C51.2 ; port DDI_B_TX3-
TMD_CK_P: C50.2 ; port DDI_B_TX3+
TMD_D0_N: C49.2 ; port DDI_B_TX2-
TMD_D0_P: C48.2 ; port DDI_B_TX2+
TMD_D1_N: C47.2 ; port DDI_B_TX1-
TMD_D1_P: C46.2 ; port DDI_B_TX1+
TMD_D2_N: C45.2 ; port DDI_B_TX0-
TMD_D2_P: C44.2 ; port DDI_B_TX0+
TMDS_CK_N: C51.1 J10.12(TMDS_Clock-) R45.2(B) U20.5(I/O)
TMDS_CK_P: C50.1 J10.10(TMDS_Clock+) R44.2(B) U20.4(I/O)
TMDS_D0_N: C49.1 J10.9(TMDS_Data0-) R43.2(B) U20.2(I/O)
TMDS_D0_P: C48.1 J10.7(TMDS_Data0+) R42.2(B) U20.1(I/O)
TMDS_D1_N: C47.1 J10.6(TMDS_Data1-) R41.2(B) U19.5(I/O)
TMDS_D1_P: C46.1 J10.4(TMDS_Data1+) R40.2(B) U19.4(I/O)
TMDS_D2_N: C45.1 J10.3(TMDS_Data2–) R39.2(B) U19.2(I/O)
TMDS_D2_P: C44.1 J10.1(TMDS_Data2+) R38.2(B) U19.1(I/O)
NetF5_1: F5.1 J10.18(+5V_Power)
NetJ3_169: Q4.3(D) R49.2(B) ; port DDI_B_DDC_SDA
NetJ3_171: Q3.3(D) R50.2(B) ; port DDI_B_DDC_SCL
NetJ3_183: Q5.3(D) R51.2(B) ; port DDI_B_HPD
NetQ2_1: Q2.1(G) R46.2(B)
NetQ2_3: Q2.3(D) R38.1(A) R39.1(A) R40.1(A) R41.1(A) R42.1(A) R43.1(A) R44.1(A) R45.1(A)
NetQ3_1: Q3.1(G) Q4.1(G)
NetQ5_2: Q5.2(S) R52.1(A) R53.1(A)

Not connected (* = marked no-connect by the designer): J10 13(CEC)* 14(Utility_/_HEAC+)*; U19 6(NC)* 7(NC)* 9(NC)* 10(NC)*; U20 6(NC)* 7(NC)* 9(NC)* 10(NC)*

### Layout directives
mark named HDMI: TMD_CK_N, TMD_CK_P, TMD_D0_N, TMD_D0_P, TMD_D1_N, TMD_D1_P, TMD_D2_N, TMD_D2_P, TMDS_CK_N, TMDS_CK_P, TMDS_D0_N, TMDS_D0_P, TMDS_D1_N, TMDS_D1_P, TMDS_D2_N, TMDS_D2_P
differential pair; differential pair class 100_OHM_DIFF: TMD_CK_N, TMD_CK_P, TMD_D0_N, TMD_D0_P, TMD_D1_N, TMD_D1_P, TMD_D2_N, TMD_D2_P, TMDS_CK_N, TMDS_CK_P, TMDS_D0_N, TMDS_D0_P, TMDS_D1_N, TMDS_D1_P, TMDS_D2_N, TMDS_D2_P

### Notes on the sheet
- HDMI
- TVS Diode
- Title
- Size:
- Date:
- B
- Number:
- Time:
- Revision:
- Sheet
- of
- File:

### Library data of the parts
C44-C52 = Capacitor 0402: Capacitor Ceramico SMD 0402
D12 = 1N5819WS: Diodos 40 V 1A Montaje en superficie SOD-323; Manufacturer_Name: MCC; Manufacturer_Part_Number: SD103AWS-TP; Copyright: Copyright (C) 2025 Ultra Librarian. All rights reserved.
D13-D15 = PESD5V0S1BAF: as D7 on sheet [2] Power_Supply; Mouser Part Number: 771-PESD5V0S1BAF; Mouser Price/Stock: https://www.mouser.co.uk/ProductDetail/Nexperia/PESD5V0S1BAF?qs=45Avz0nZxhtk8Fj2r0tKWQ%3D%3D; Manufacturer_Part_Number: PESD5V0S1BAF; Datasheet Link: https://assets.nexperia.com/documents/data-sheet/PESD5V0S1BA.pdf
F5 = 0603L100SLYR: as F1 on sheet [6] USB; SnapEDA_Link: https://www.snapeda.com/parts/0603L100SLYR/Littelfuse/view-part/?ref=snap; Package: Package; Value: *; MF: Littelfuse; MP: 0603L100SLYR; Check_prices: https://www.snapeda.com/parts/0603L100SLYR/Littelfuse/view-part/?ref=eda
J10 = 685119134923: WR-COM HDMI SMT Horizontal, Receptacle, Type A; Manufacturer: Wurth Elektronik; Match Code: WR-HDMI; Connector Type: Type A; Contact Resistance: 30mOhm; Rated Current: 0.5A; Working Voltage: 40VAC; Manufacturer Part Number: 685119134923; Category: Input/Output Connectors; ComponentLink1Description: Website Link; ComponentLink1URL: https://www.we-online.com/redexpert/article/685119134923?ad; ComponentLink2Description: Datasheet Link; ComponentLink2URL: https://www.we-online.com/redexpert/spec/685119134923?ad; Mount: Surface Mount; Operating Temperature Max: 85°C; Operating Temperature Min: -25°C; Packaging: Tape and Reel; Gender: Receptacle; Number of Pins: 19; Orientation: Horizontal
Q2-Q4 = 2SK3018: Canal N Montaje en superficie 30 V 100mA 200mW SOT-23; Manufacturer_Name: onsemi; Manufacturer_Part_Number: 2N7002; Geometry.Height: 1.2mm; Mouser Part Number: 512-2N7002; Mouser Price/Stock: https://www.mouser.co.uk/ProductDetail/onsemi-Fairchild/2N7002?qs=0dwsXDNhqlz66WJJhrTFjQ%3D%3D; Datasheet Link: https://www.onsemi.com/pub/Collateral/NDS7002A-D.PDF
Q5 = 2N7002: Mosfet N SOT23
R38-R53 = Resistencia SMD 0402
U19 U20 = D3V3XA4B10LP: as U12 on sheet [6] USB

## Sheet [8] Sockets.SchDoc
size B; Organization: Altium Limited; Address1: L3, 12a Rodborough Rd; Address2: Frenchs Forest; Address3: NSW; Address4: Australia 2086
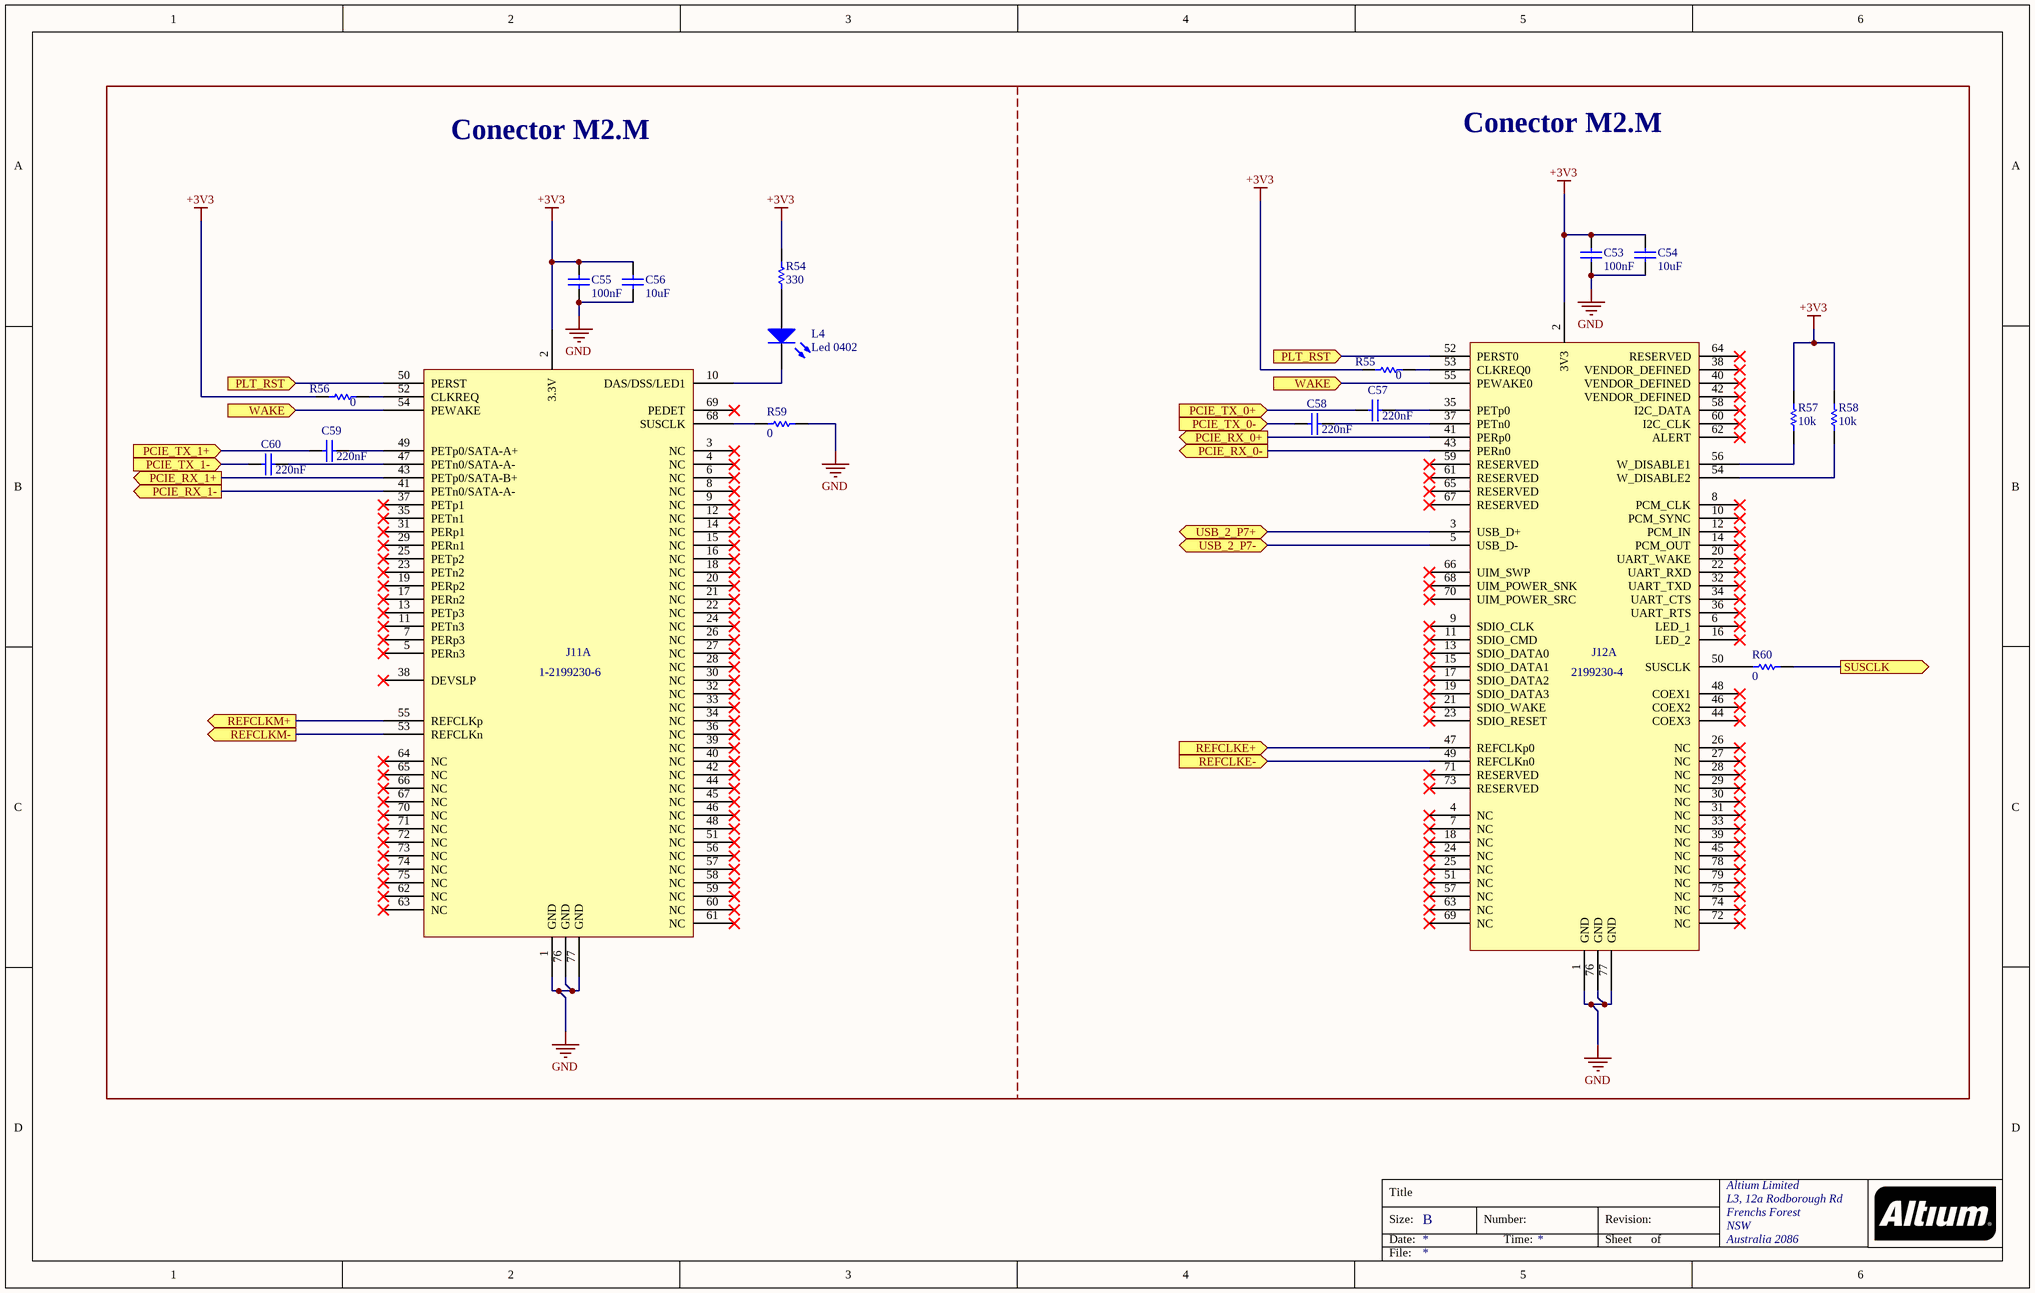
[diagram p7: [8] Sockets.SchDoc]

### Parts
C53  100nF  [Capacitor 0402]
C54  10uF  [Capacitor 0402]
C55  100nF  [Capacitor 0402]
C56  10uF  [Capacitor 0402]
C57  220nF  [Capacitor 0402]
C58  220nF  [Capacitor 0402]
C59  220nF  [Capacitor 0402]
C60  220nF  [Capacitor 0402]
J11  1-2199230-6  [CONN67_2199230_TEC]  (part A of 2)
J12  2199230-4  [CONN67_2199230_TEC]  (part A of 2)
L4  Led 0402  [LED 0402]
R54  330  [Resistencia 0402]
R55  0  [Resistencia 0402]
R56  0  [Resistencia 0402]
R57  10k  [Resistencia 0402]
R58  10k  [Resistencia 0402]
R59  0  [Resistencia 0402]
R60  0  [Resistencia 0402]

### Ports
PCIE_RX_0+ (out), PCIE_RX_0- (out), PCIE_RX_1+ (out), PCIE_RX_1- (out), PCIE_TX_0+ (in), PCIE_TX_0- (in), PCIE_TX_1+ (in), PCIE_TX_1- (in), PLT_RST (in), REFCLKE+ (in), REFCLKE- (in), REFCLKM+ (out), REFCLKM- (out), SUSCLK (out), USB_2_P7+ (bidir), USB_2_P7- (bidir), WAKE (in)

### Nets
+3V3: C53.2 C54.2 C55.2 C56.2 J11.2(3.3V) J12.2(3V3) R54.2(B) R55.1(A) R56.1(A) R57.2(B) R58.2(B)
GND: C53.1 C54.1 C55.1 C56.1 J11.1(GND) J11.76(GND) J11.77(GND) J12.1(GND) J12.76(GND) J12.77(GND) R59.1(A)
PLTRST: J11.50(PERST) J12.52(PERST0) ; port PLT_RST
WAKE: J11.54(PEWAKE) J12.55(PEWAKE0) ; port WAKE
NetC57_1: C57.1 J12.35(PETp0)
NetC57_2: C57.2 ; port PCIE_TX_0+
NetC58_1: C58.1 J12.37(PETn0)
NetC58_2: C58.2 ; port PCIE_TX_0-
NetC59_1: C59.1 J11.49(PETp0/SATA-A+)
NetC59_2: C59.2 ; port PCIE_TX_1+
NetC60_1: C60.1 J11.47(PETn0/SATA-A-)
NetC60_2: C60.2 ; port PCIE_TX_1-
NetJ3_28: J11.43(PETp0/SATA-B+) ; port PCIE_RX_1+
NetJ3_30: J11.41(PETn0/SATA-A-) ; port PCIE_RX_1-
NetJ3_34: J12.41(PERp0) ; port PCIE_RX_0+
NetJ3_36: J12.43(PERn0) ; port PCIE_RX_0-
NetJ3_76: J12.3(USB_D+) ; port USB_2_P7+
NetJ3_78: J12.5(USB_D-) ; port USB_2_P7-
NetJ3_85: J11.55(REFCLKp) ; port REFCLKM+
NetJ3_87: J11.53(REFCLKn) ; port REFCLKM-
NetJ3_88: J12.47(REFCLKp0) ; port REFCLKE+
NetJ3_90: J12.49(REFCLKn0) ; port REFCLKE-
NetJ3_131: R60.1(A) ; port SUSCLK
NetJ11_10: J11.10(DAS/DSS/LED1) L4.2(K)
NetJ11_52: J11.52(CLKREQ) R56.2(B)
NetJ11_68: J11.68(SUSCLK) R59.2(B)
NetJ12_50: J12.50(SUSCLK) R60.2(B)
NetJ12_53: J12.53(CLKREQ0) R55.2(B)
NetJ12_54: J12.54(W_DISABLE2) R58.1(A)
NetJ12_56: J12.56(W_DISABLE1) R57.1(A)
NetL4_1: L4.1(A) R54.1(A)

Not connected (* = marked no-connect by the designer): J11 3(NC)* 4(NC)* 5(PERn3_)* 6(NC)* 7(PERp3)* 8(NC)* 9(NC)* 11(PETn3)* 12(NC)* 13(PETp3)* 14(NC)* 15(NC)* 16(NC)* 17(PERn2_)* 18(NC)* 19(PERp2)* 20(NC)* 21(NC)* 22(NC)* 23(PETn2)* 24(NC)* 25(PETp2)* 26(NC)* 27(NC)* 28(NC)* 29(PERn1_)* 30(NC)* 31(PERp1)* 32(NC)* 33(NC)* 34(NC)* 35(PETn1_)* 36(NC)* 37(PETp1)* 38(DEVSLP)* 39(NC)* 40(NC)* 42(NC)* 44(NC)* 45(NC)* 46(NC)* 48(NC)* 51(NC)* 56(NC)* 57(NC)* 58(NC)* 59(NC)* 60(NC)* 61(NC)* 62(NC)* 63(NC)* 64(NC)* 65(NC)* 66(NC)* 67(NC)* 69(PEDET)* 70(NC)* 71(NC)* 72(NC)* 73(NC)* 74(NC)* 75(NC)*; J12 4(NC)* 6(LED_1)* 7(NC)* 8(PCM_CLK)* 9(SDIO_CLK)* 10(PCM_SYNC)* 11(SDIO_CMD)* 12(PCM_IN)* 13(SDIO_DATA0)* 14(PCM_OUT)* 15(SDIO_DATA1)* 16(LED_2)* 17(SDIO_DATA2)* 18(NC)* 19(SDIO_DATA3)* 20(UART_WAKE)* 21(SDIO_WAKE)* 22(UART_RXD)* 23(SDIO_RESET)* 24(NC)* 25(NC)* 26(NC)* 27(NC)* 28(NC)* 29(NC)* 30(NC)* 31(NC)* 32(UART_TXD)* 33(NC)* 34(UART_CTS)* 36(UART_RTS)* 38(VENDOR_DEFINED)* 39(NC)* 40(VENDOR_DEFINED)* 42(VENDOR_DEFINED)* 44(COEX3)* 45(NC)* 46(COEX2)* 48(COEX1)* 51(NC)* 57(NC)* 58(I2C_DATA)* 59(RESERVED)* 60(I2C_CLK)* 61(RESERVED)* 62(ALERT)* 63(NC)* 64(RESERVED)* 65(RESERVED)* 66(UIM_SWP)* 67(RESERVED)* 68(UIM_POWER_SNK)* 69(NC)* 70(UIM_POWER_SRC)* 71(RESERVED)* 72(NC)* 73(RESERVED)* 74(NC)* 75(NC)* 78(NC)* 79(NC)*

### Notes on the sheet
- Conector M2.M
- Title
- Size:
- Date:
- B
- Number:
- Time:
- Revision:
- Sheet
- of
- File:

### Library data of the parts
C53-C60 = Capacitor 0402: Capacitor Ceramico SMD 0402
J11 = 1-2199230-6: M.2 0.5PITCH 4.2H KEY M 30U AU; Manufacturer_Name: TE Connectivity; Copyright: Copyright (C) 2026 Ultra Librarian. All rights reserved.; Manufacturer_Part_Number: 1-2199230-6; RefDes: RefDes; Type: Type
J12 = 2199230-4: M.2 0.5PITCH 4.2H KEY E 15U'' AU; Manufacturer_Name: TE Connectivity; Copyright: Copyright (C) 2026 Ultra Librarian. All rights reserved.; Manufacturer_Part_Number: 2199230-4; RefDes: RefDes; Type: Type
L4 = LED 0402: LED SMD 0402
R54-R60 = Resistencia SMD 0402

## Sheet [3] Fan.SchDoc
size A; Organization: Altium Limited; Address1: L3, 12a Rodborough Rd; Address2: Frenchs Forest; Address3: NSW; Address4: Australia 2086
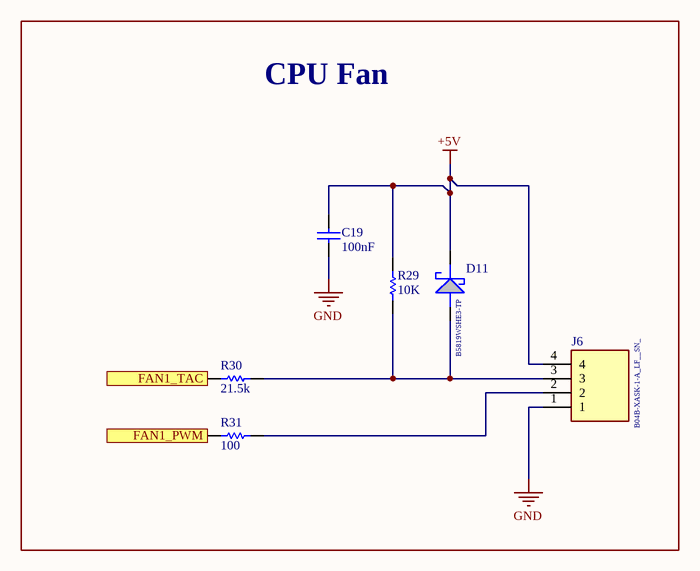
[diagram p8: [3] Fan.SchDoc]

### Parts
C19  100nF  [Capacitor 0402]
D11  B5819WSHE3-TP  [SOD2512X115N]
J6  B04B-XASK-1-A_LF__SN_  [B04BXASK1ALFSN]
R29  10K  [Resistencia 0402]
R30  21.5k  [Resistencia 0402]
R31  100  [Resistencia 0402]

### Blocks framed on the sheet
CPU Fan: C19 D11 J6 R29-R31

### Ports
FAN1_PWM (in), FAN1_TAC (out)

### Nets
+5V: C19.2 D11.1(K) J6.4 R29.2(B)
GND: C19.1 J6.1
NetD11_2: D11.2(A) J6.3 R29.1(A) R30.2(B)
NetJ3_2: R31.1(A) ; port FAN1_PWM
NetJ3_4: R30.1(A) ; port FAN1_TAC
NetJ6_2: J6.2 R31.2(B)

### Notes on the sheet
- Title
- Size:
- Date:
- A
- Number:
- Time:
- Revision:
- Sheet
- of
- File:

### Library data of the parts
C19 = Capacitor 0402: Capacitor Ceramico SMD 0402
D11 = B5819WSHE3-TP: 1 Amp Schottky Barrier Rectifier 20 - 40 Volts SOD-323; Manufacturer_Name: MCC; Geometry.Height: 1.15mm; Mouser Part Number: 833-B5819WSHE3-TP; Mouser Price/Stock: https://www.mouser.co.uk/ProductDetail/Micro-Commercial-Components-MCC/B5819WSHE3-TP?qs=rSMjJ%252B1ewcQA3fzC3crCWg%3D%3D; Manufacturer_Part_Number: B5819WSHE3-TP; Datasheet Link: https://www.mccsemi.com/pdf/Products/B5817WSHE3-B5819WSHE3(SOD-323).pdf
J6 = B04B-XASK-1-A_LF__SN_: Connector Header Through Hole 4 position 0.098" (2.50mm); Manufacturer_Name: JST (JAPAN SOLDERLESS TERMINALS); Manufacturer_Part_Number: B04B-XASK-1-A(LF)(SN); Geometry.Height: 8.8mm; Mouser Part Number: 306-B04BXASK1ALFSN; Mouser Price/Stock: https://www.mouser.co.uk/ProductDetail/JST-Commercial/B04B-XASK-1-ALFSN?qs=QpmGXVUTftEXYaWwXjA%2FfQ%3D%3D; Datasheet Link: https://www.jst-india.com/downloads/series/eXA-WB_(21-03-22).pdf
R29-R31 = Resistencia SMD 0402